# Altium project cm4gateway.PrjPcb (part 2 of 2)

## Sheet CPU_superviser.SchDoc: UNUSED INTERFACES
size A3; Engineer: M.GUENI; Revision: R0; SheetNumber: 10; SheetTotal: 10
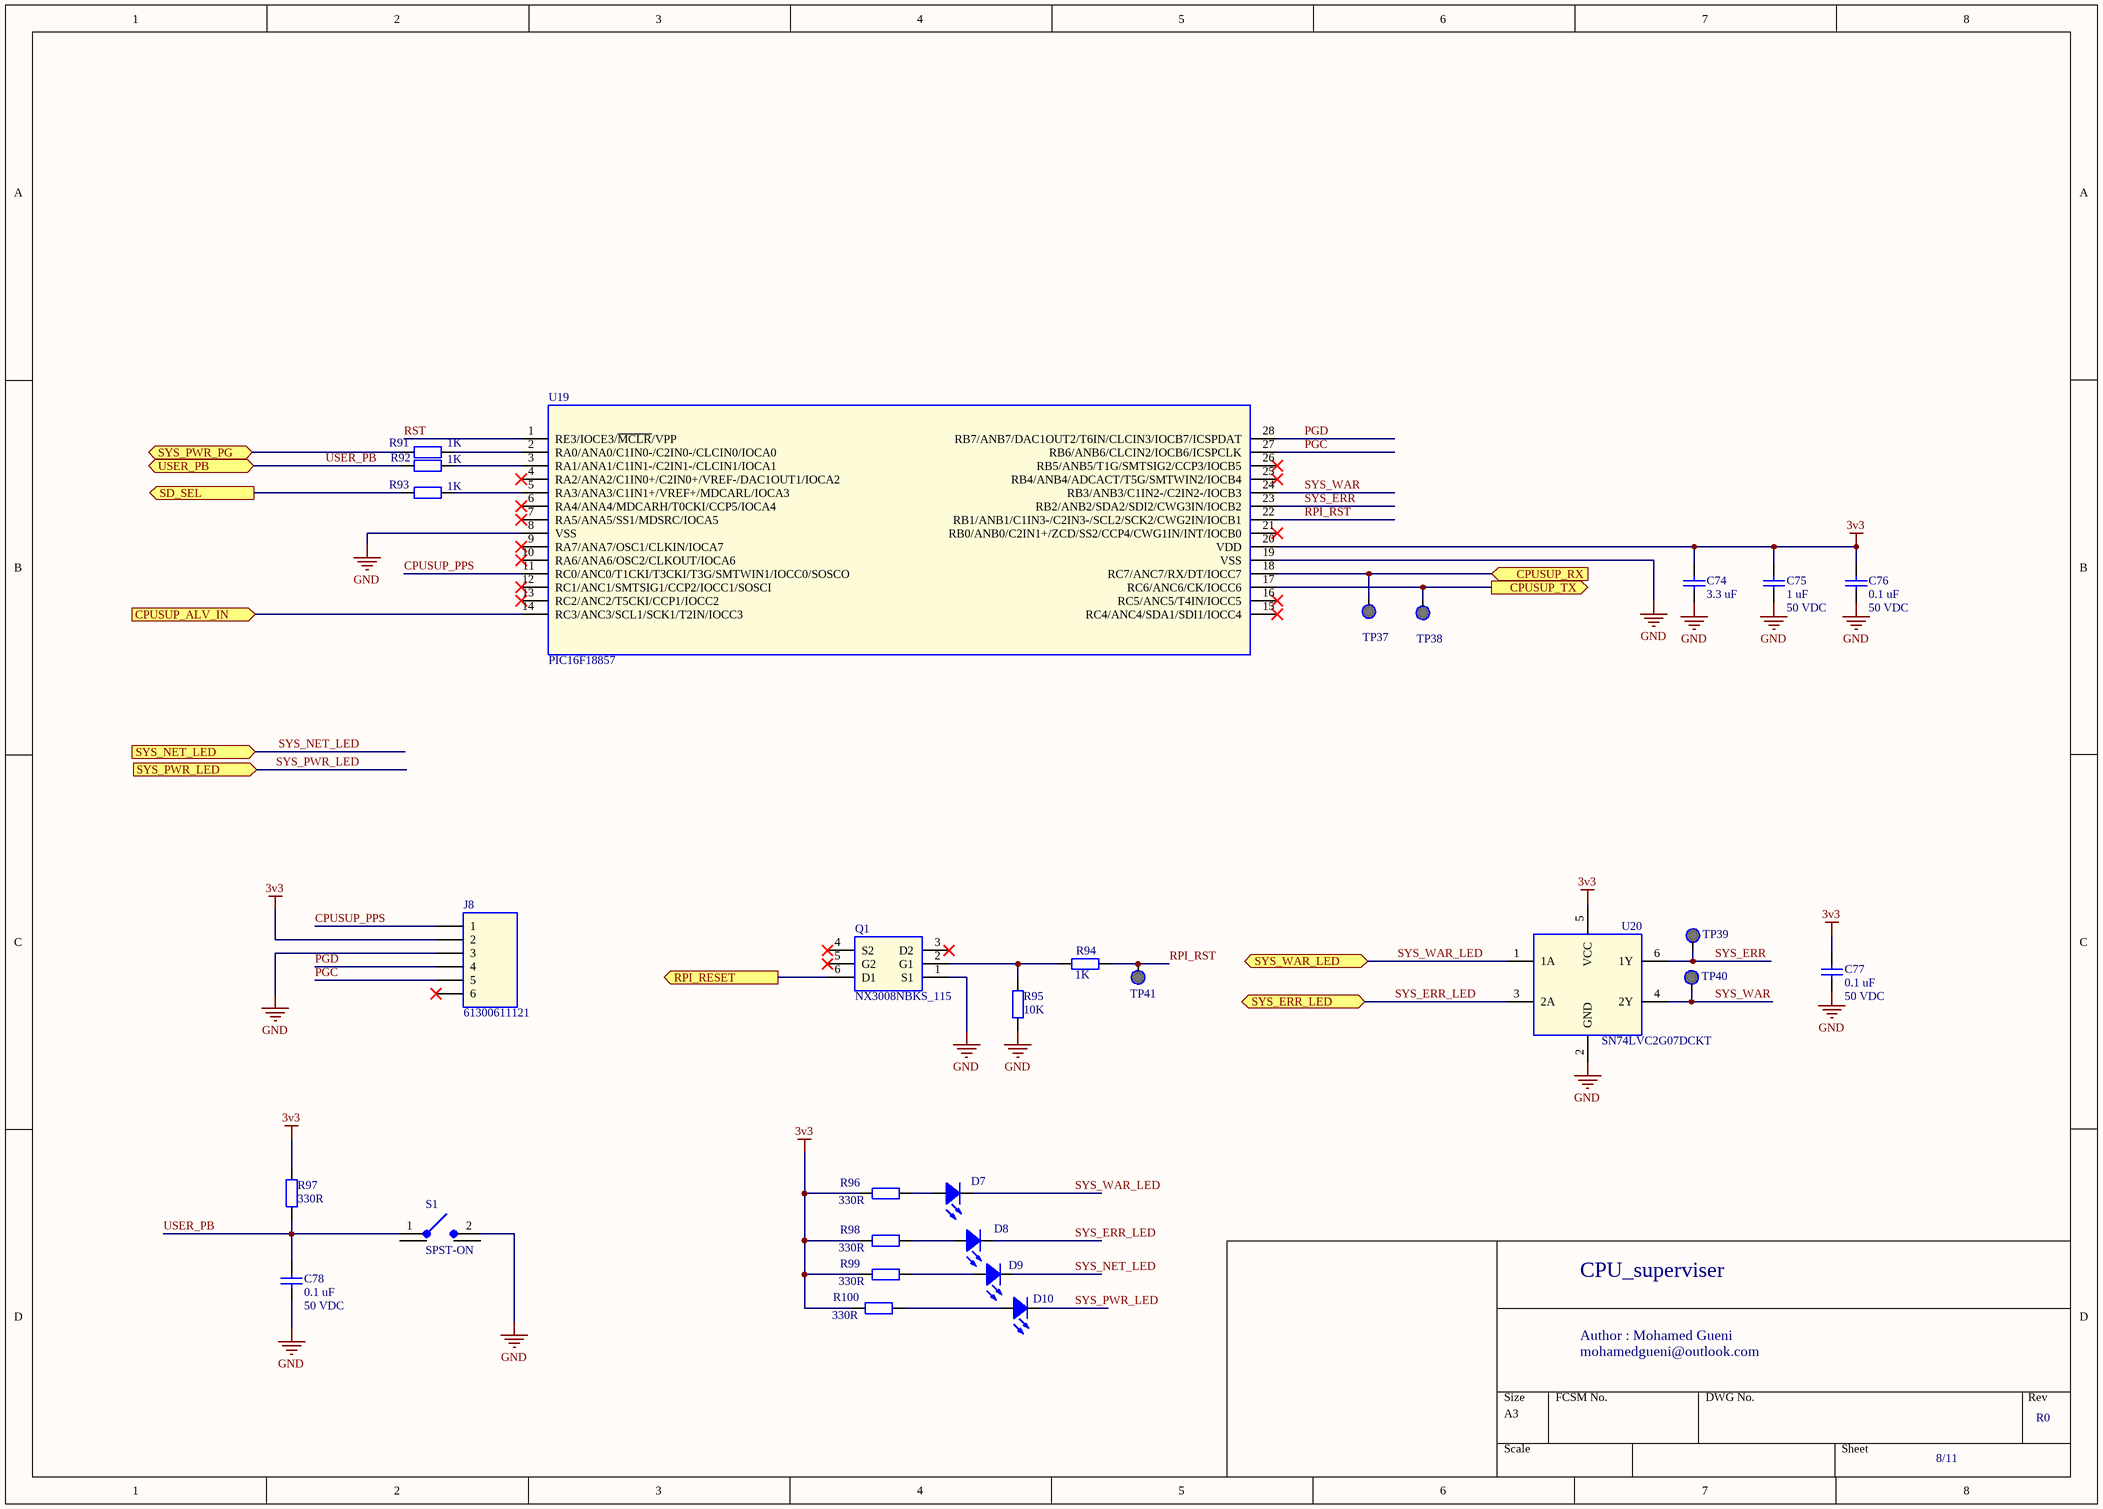
[diagram p9: CPU_superviser.SchDoc]

### Parts
C74  Value 1: 3.3 uF  [CAPC1608N]  (hidden comment: Capacitor)
C75  Value 1: 1 uF  Value 2: 50 VDC  [CAPC1608N]  (hidden comment: Capacitor)
C76  Value 1: 0.1 uF  Value 2: 50 VDC  [CAPC1608N]  (hidden comment: Capacitor)
C77  Value 1: 0.1 uF  Value 2: 50 VDC  [CAPC1608N]  (hidden comment: Capacitor)
C78  Value 1: 0.1 uF  Value 2: 50 VDC  [CAPC1608N]  (hidden comment: Capacitor)
D7  150060BS75000  [LED0603]  (value not drawn)
D8  150060RS75000  [LED0603]  (value not drawn)
D9  150060GS75000  [LED0603]  (value not drawn)
D10  150060GS75000  [LED0603]  (value not drawn)
J8  61300611121  [HDRV6W64P0X254]
Q1  NX3008NBKS_115  [SOT65P210X110-6N]
R91  Value 1: 1K  [RESC1608N]  (hidden comment: Resistor)
R92  Value 1: 1K  [RESC1608N]  (hidden comment: Resistor)
R93  Value 1: 1K  [RESC1608N]  (hidden comment: Resistor)
R94  Value 1: 1K  [RESC1608N]  (hidden comment: Resistor)
R95  Value 1: 10K  [RESC1608N]  (hidden comment: Resistor)
R96  Value 1: 330R  [RESC1608N]  (hidden comment: Resistor)
R97  Value 1: 330R  [RESC1608N]  (hidden comment: Resistor)
R98  Value 1: 330R  [RESC1608N]  (hidden comment: Resistor)
R99  Value 1: 330R  [RESC1608N]  (hidden comment: Resistor)
R100  Value 1: 330R  [RESC1608N]  (hidden comment: Resistor)
S1  SPST-ON  [118250272]
TP37  Test Point  [TP]  (value not drawn)  (no BOM)
TP38  Test Point  [TP]  (value not drawn)  (no BOM)
TP39  Test Point  [TP]  (value not drawn)  (no BOM)
TP40  Test Point  [TP]  (value not drawn)  (no BOM)
TP41  Test Point  [TP]  (value not drawn)  (no BOM)
U19  PIC16F18857  [SOP65P780X200-28N]
U20  SN74LVC2G07DCKT  [SOT65P210X1106N]

### Ports
CPUSUP_ALV_IN (in), CPUSUP_RX (in), CPUSUP_TX (out), RPI_RESET (out), SD_SEL (out), SYS_ERR_LED (bidir), SYS_NET_LED (in), SYS_PWR_LED (in), SYS_PWR_PG (bidir), SYS_WAR_LED (bidir), USER_PB (bidir)

### Nets
3V3: C74.2 C75.2 C76.2 C77.2 J8.2 R96.1 R97.2 R98.1 R99.1 R100.1 U19.20(VDD) U20.5(VCC)
GND: C74.1 C75.1 C76.1 C77.1 C78.1 J8.3 Q1.1(S1) R95.1 S1.2(NO) U19.8(VSS) U19.19(VSS) U20.2(GND)
CPUSUP_PPS: J8.1 U19.11(RC0/ANC0/T1CKI/T3CKI/T3G/SMTWIN1/IOCC0/SOSCO)
PGC: J8.5 U19.27(RB6/ANB6/CLCIN2/IOCB6/ICSPCLK)
PGD: J8.4 U19.28(RB7/ANB7/DAC1OUT2/T6IN/CLCIN3/IOCB7/ICSPDAT)
RPI_RST: R94.2 TP41.1 U19.22(RB1/ANB1/C1IN3-/C2IN3-/SCL2/SCK2/CWG2IN/IOCB1)
RPi_RXD3: TP38.1 U19.17(RC6/ANC6/CK/IOCC6) ; port CPUSUP_TX
RPi_TXD3: TP37.1 U19.18(RC7/ANC7/RX/DT/IOCC7) ; port CPUSUP_RX
RST: U19.1(RE3/IOCE3/~{MCLR}/VPP)
SEL_SD: R93.1 ; port SD_SEL
SYS_ERR: TP39.1 U19.23(RB2/ANB2/SDA2/SDI2/CWG3IN/IOCB2) U20.6(1Y)
SYS_ERR_LED: D8.1(K) U20.3(2A) ; port SYS_ERR_LED
SYS_NET_LED: D9.1(K) ; port SYS_NET_LED
SYS_PWR_LED: D10.1(K) ; port SYS_PWR_LED
SYS_WAR: TP40.1 U19.24(RB3/ANB3/C1IN2-/C2IN2-/IOCB3) U20.4(2Y)
SYS_WAR_LED: D7.1(K) U20.1(1A) ; port SYS_WAR_LED
USER_PB: C78.2 R92.1 R97.1 S1.1(COM) ; port USER_PB
NetD7_2: D7.2(A) R96.2
NetD8_2: D8.2(A) R98.2
NetD9_2: D9.2(A) R99.2
NetD10_2: D10.2(A) R100.2
NetQ1_2: Q1.2(G1) R94.1 R95.2
NetQ1_6: Q1.6(D1) ; port RPI_RESET
NetR15_2: R91.1 ; port SYS_PWR_PG
NetR91_2: R91.2 U19.2(RA0/ANA0/C1IN0-/C2IN0-/CLCIN0/IOCA0)
NetR92_2: R92.2 U19.3(RA1/ANA1/C1IN1-/C2IN1-/CLCIN1/IOCA1)
NetR93_2: R93.2 U19.5(RA3/ANA3/C1IN1+/VREF+/MDCARL/IOCA3)
NetU4_58: U19.14(RC3/ANC3/SCL1/SCK1/T2IN/IOCC3) ; port CPUSUP_ALV_IN

Not connected (* = marked no-connect by the designer): J8 6*; Q1 3(D2)* 4(S2)* 5(G2)*; S1 MH1 MH2; U19 4(RA2/ANA2/C1IN0+/C2IN0+/VREF-/DAC1OUT1/IOCA2)* 6(RA4/ANA4/MDCARH/T0CKI/CCP5/IOCA4)* 7(RA5/ANA5/SS1/MDSRC/IOCA5)* 9(RA7/ANA7/OSC1/CLKIN/IOCA7)* 10(RA6/ANA6/OSC2/CLKOUT/IOCA6)* 12(RC1/ANC1/SMTSIG1/CCP2/IOCC1/SOSCI)* 13(RC2/ANC2/T5CKI/CCP1/IOCC2)* 15(RC4/ANC4/SDA1/SDI1/IOCC4)* 16(RC5/ANC5/T4IN/IOCC5)* 21(RB0/ANB0/C2IN1+/ZCD/SS2/CCP4/CWG1IN/INT/IOCB0)* 25(RB4/ANB4/ADCACT/T5G/SMTWIN2/IOCB4)* 26(RB5/ANB5/T1G/SMTSIG2/CCP3/IOCB5)*

### Notes on the sheet
- CPU_superviser
- Author : Mohamed Gueni
- mohamedgueni@outlook.com
- 8/11
- R0
- Title:
- Micro Device Tunisie
- Size:
- Date:
- File:
- A3
- Engineer :
- Revision:
- Sheet
- of
- Cyber Parc  Hammam Sousse
- Avenue Charles De Gaulle
- 4011, Hammam-Sousse, Tunisie
- contact@mdtunisie.com

### Library data of the parts
C74 = CAP-000000065: Part Number: CAP-000000008; FTP: 0603
C75 = CAP-000000062: Part Number: CAP-000000005; MAN: KEMET; MANREF: C0603C105K8PACTU; DES: Multilayer Ceramic Capacitors MLCC - SMD/SMT 10v 1uF X5R 0603 10%; TOL: 10 %; FTP: 0603; SUP: Mouser; SUPREF: 80-C0603C105K8P; NOTE: _
C76-C78 = CAP-000000060: Part Number: CAP-000000003; MAN: KEMET; MANREF: C0603C104M5RAC; DES: Multilayer Ceramic Capacitors MLCC - SMD/SMT 50V 0.1uF 0603 X7R 20%; TOL: 20 %; FTP: 0603; SUP: Mouser; SUPREF: 80-C0603C104M5RAC; NOTE: _
D7 = LED-000000008: Part Number: LED-000000003; MAN: Wurth Elektronik; DES: Standard LEDs - SMD WL-SMCW SMDMono TpVw Waterclr 0603 Blue; Value 1: 0.02A; Value 2: 3.2 V; TOL: _; FTP: 0603; SUP: Mouser; SUPREF: 710-150060BS75000; MANREF: 150060BS75000; NOTE: _
D8 = LED-000000006: Part Number: LED-000000001; MAN: Wurth Elektronik; DES: Standard LEDs - SMD WL-SMCW SMDMono TpVw Waterclr 0603 Red; Value 1: 0.02A; Value 2: 2 V; TOL: _; FTP: 0603; SUP: Mouser; SUPREF: 710-150060RS75000; MANREF: 150060RS75000; NOTE: _
D9 D10 = LED-000000007: Part Number: LED-000000002; MAN: Wurth Elektronik; DES: Standard LEDs - SMD WL-SMCW SMDMono TpVw Waterclr 0603 Green; Value 1: 0.02A; Value 2: 3.2 V; TOL: _; FTP: 0603; SUP: Mouser; SUPREF: 710-150060GS75000; MANREF: 150060GS75000; NOTE: _
J8 = CON-000000010: MAN: Wurth Elektronik; DES: Headers & Wire Housings WR-PHD 2.54mm 6Pin T HT Header; Value 1: _; FTP: THT; SUP: Mouser; SUPREF: 710-61300611121; Part Number: CON-000000010; MANREF: 61300611121; Value 2: _; TOL: _; NOTE: _
Q1 = TRM-000000005: Part Number: TRM-000000002; MAN: Nexperia; MANREF: NX3008NBKS,115; DES: MOSFETs 30 V, 350 mA dual N-channel Trench MOSFET; Value 1: 350 mA; Value 2: 30V; TOL: _; FTP: TSSOP-6; SUP: Mouser; SUPREF: 771-NX3008NBKS,115; NOTE: -
R91-R94 = RES-000000125: Part Number: RES-000000001; MAN: KOA Speer; MANREF: RN731JTTD1001F25; DES: Thin Film Resistors - SMD 1kOhm,0603,1%,25ppm, 63mW,50V; Value 2: 0.63W; TOL: 1%; FTP: 0603; SUP: Mouser; SUPREF: 660-RN731JTTD1001F25; NOTE: _
R95 = RES-000000131: Part Number: RES-000000007; MAN: KOA Speer; MANREF: RN731JTTD1002F25; DES: Thin Film Resistors - SMD 10kOhm,0603,1%,25ppm ,63mW,50V; Value 2: 0.63W; TOL: 1%; FTP: 0603; SUP: Mouser; SUPREF: 660-RN731JTTD1002F25; NOTE: _
R96-R100 = RES-000000132: Part Number: RES-000000008; MAN: KOA Speer; SUP: Mouser; NOTE: _
S1 = S-000000001: MAN: TE Connectivity / P&B; MANREF: 1-1825027-2; DES: Tactile Switches R/A TACT 260 PB SWITCH; Value 1: 50 mA; Value 2: 24 VDC; SUP: Mouser; SUPREF: 506-1-1825027-2; Part Number: S-000000001; NOTE: -
TP37-TP41 = MIS-000000003: Part Number: MIS-000000002; MAN: _; MANREF: _; DES: _; Value 1: _; Value 2: _; TOL: _; FTP: _; SUP: _; SUPREF: _; NOTE: _
U19 = MCU-000000003: Part Number: MCU-000000002; MAN: Microchip Technology; MANREF: PIC16F18857T-I/SS; DES: 8-bit Microcontrollers - MCU 8-Bit MCU 56KB Flash 4KB RAM 256B EE CIP; Value 1: _; FTP: SSOP-28; SUP: Mouser; SUPREF: 579-PIC16F18857TI/SS; Value 2: _; TOL: _; NOTE: _
U20 = GIC-000000009: Dual Buffer/Driver with Open-Drain Output; Manufacturer_Name: Texas Instruments; Geometry.Height: 1.1mm; DES: Buffers & Line Drivers Dual Buffer Driver A 595-SN74LVC2G07DCKR; Value 1: 5.5 V; Value 2: 32 mA; TOL: _; FTP: SOT-353-SC70-6; SUP: Mouser; SUPREF: 595-SN74LVC2G07DCKT; Mouser Part Number: 595-SN74LVC2G07DCKT; Mouser Price/Stock: https://www.mouser.co.uk/ProductDetail/Texas-Instruments/SN74LVC2G07DCKT?qs=pajgIaoyDUh%252B8BjKWdvxSw%3D%3D; Manufacturer_Part_Number: SN74LVC2G07DCKT; Datasheet Link: http://www.ti.com/lit/gpn/SN74LVC2G07; Part Number: GIC-000000009; MAN: Texas Instruments; MANREF: SN74LVC2G07DCKT; NOTE: _

## Sheet RPI.SchDoc: CELLULAR
size A2; Engineer: M.GUENI; Revision: R0; SheetNumber: 03; SheetTotal: 10
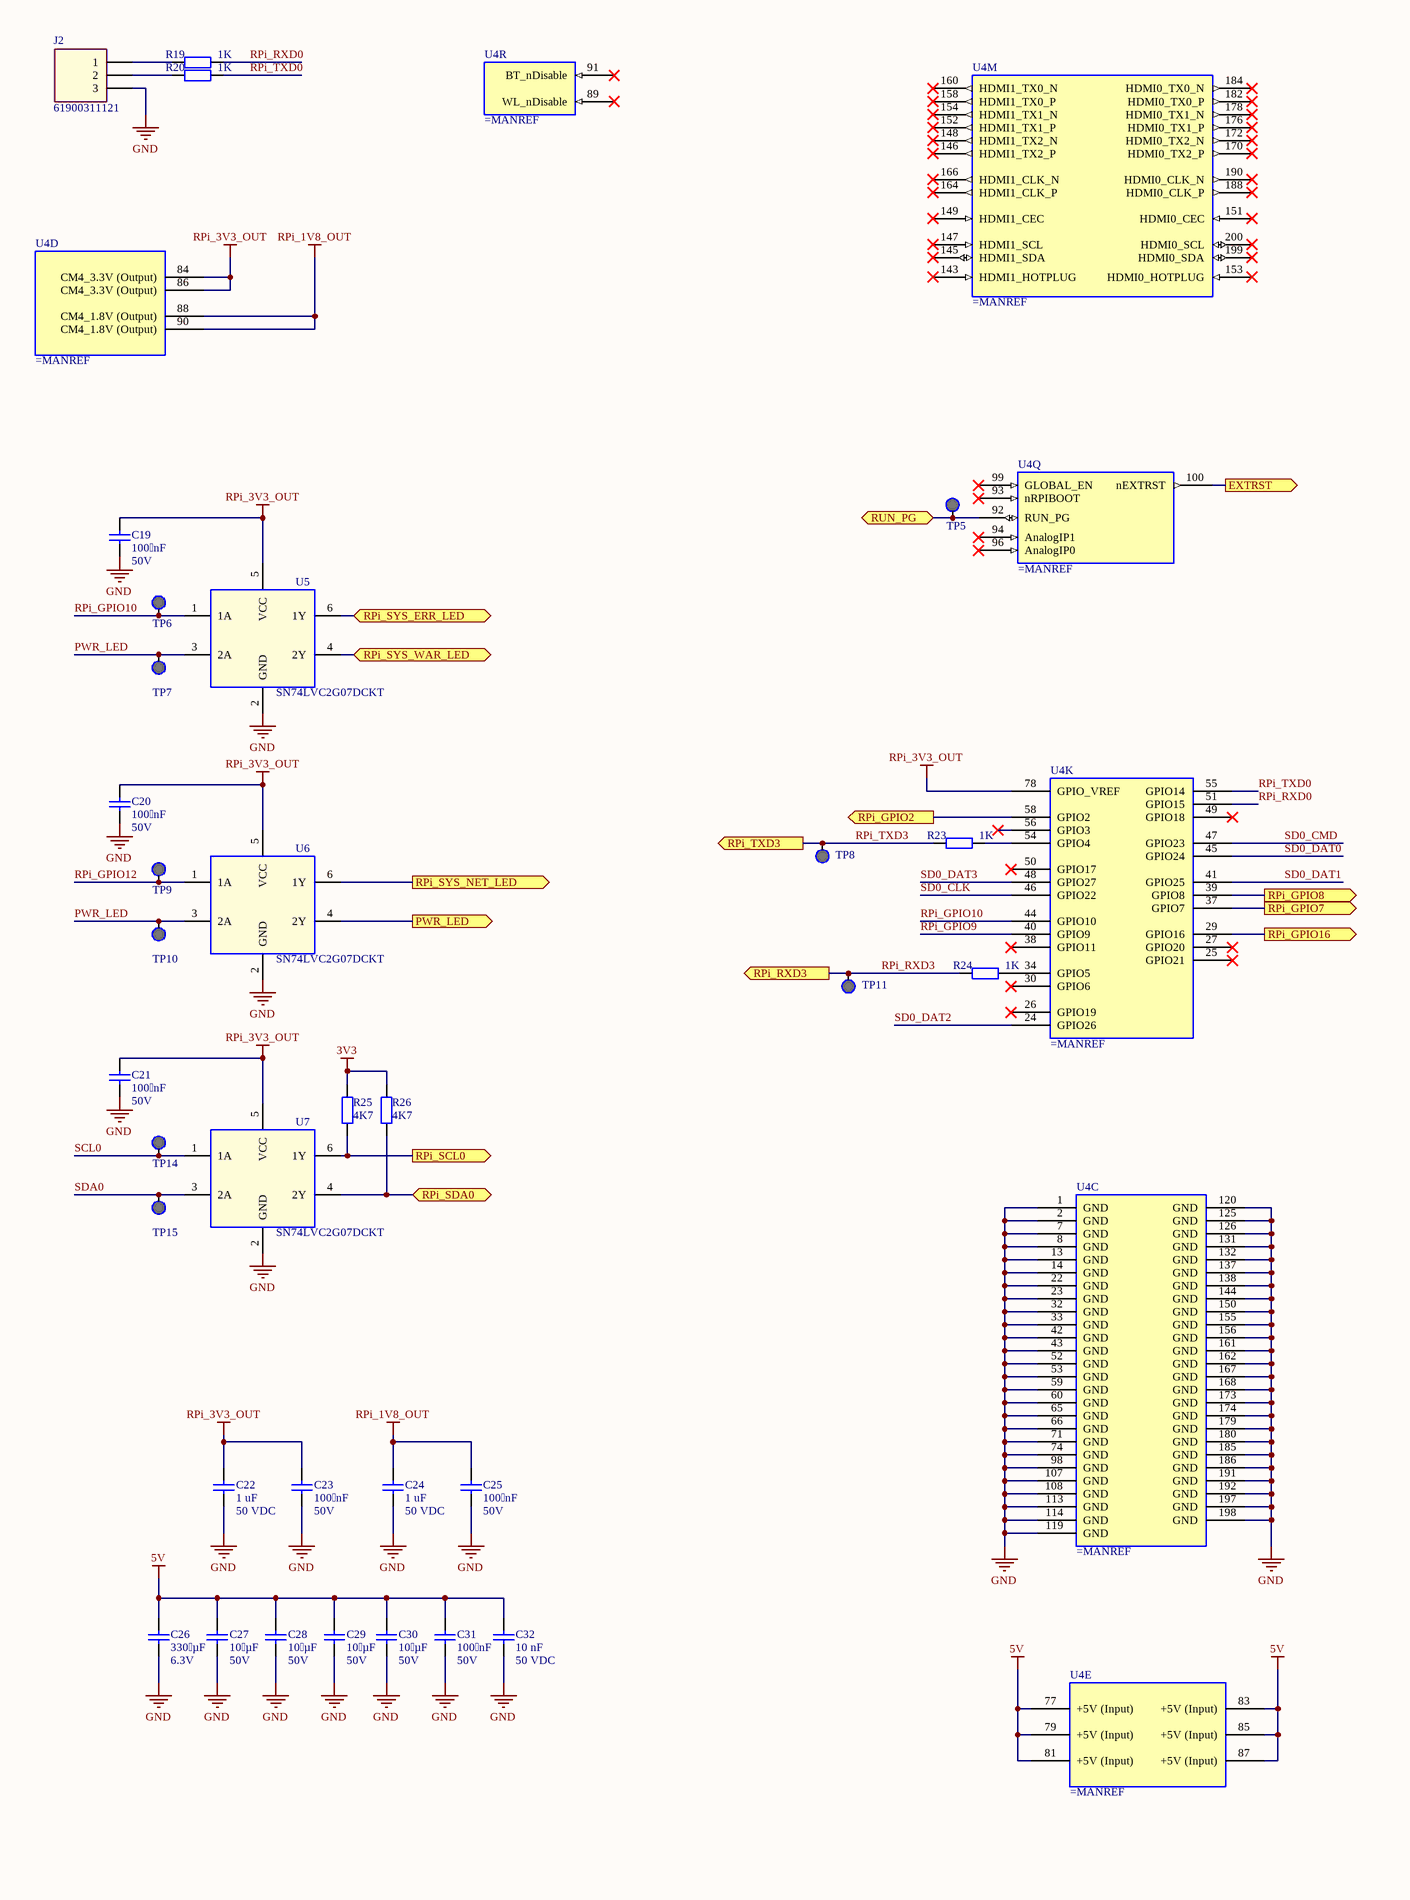
[diagram p10: RPI.SchDoc, left]
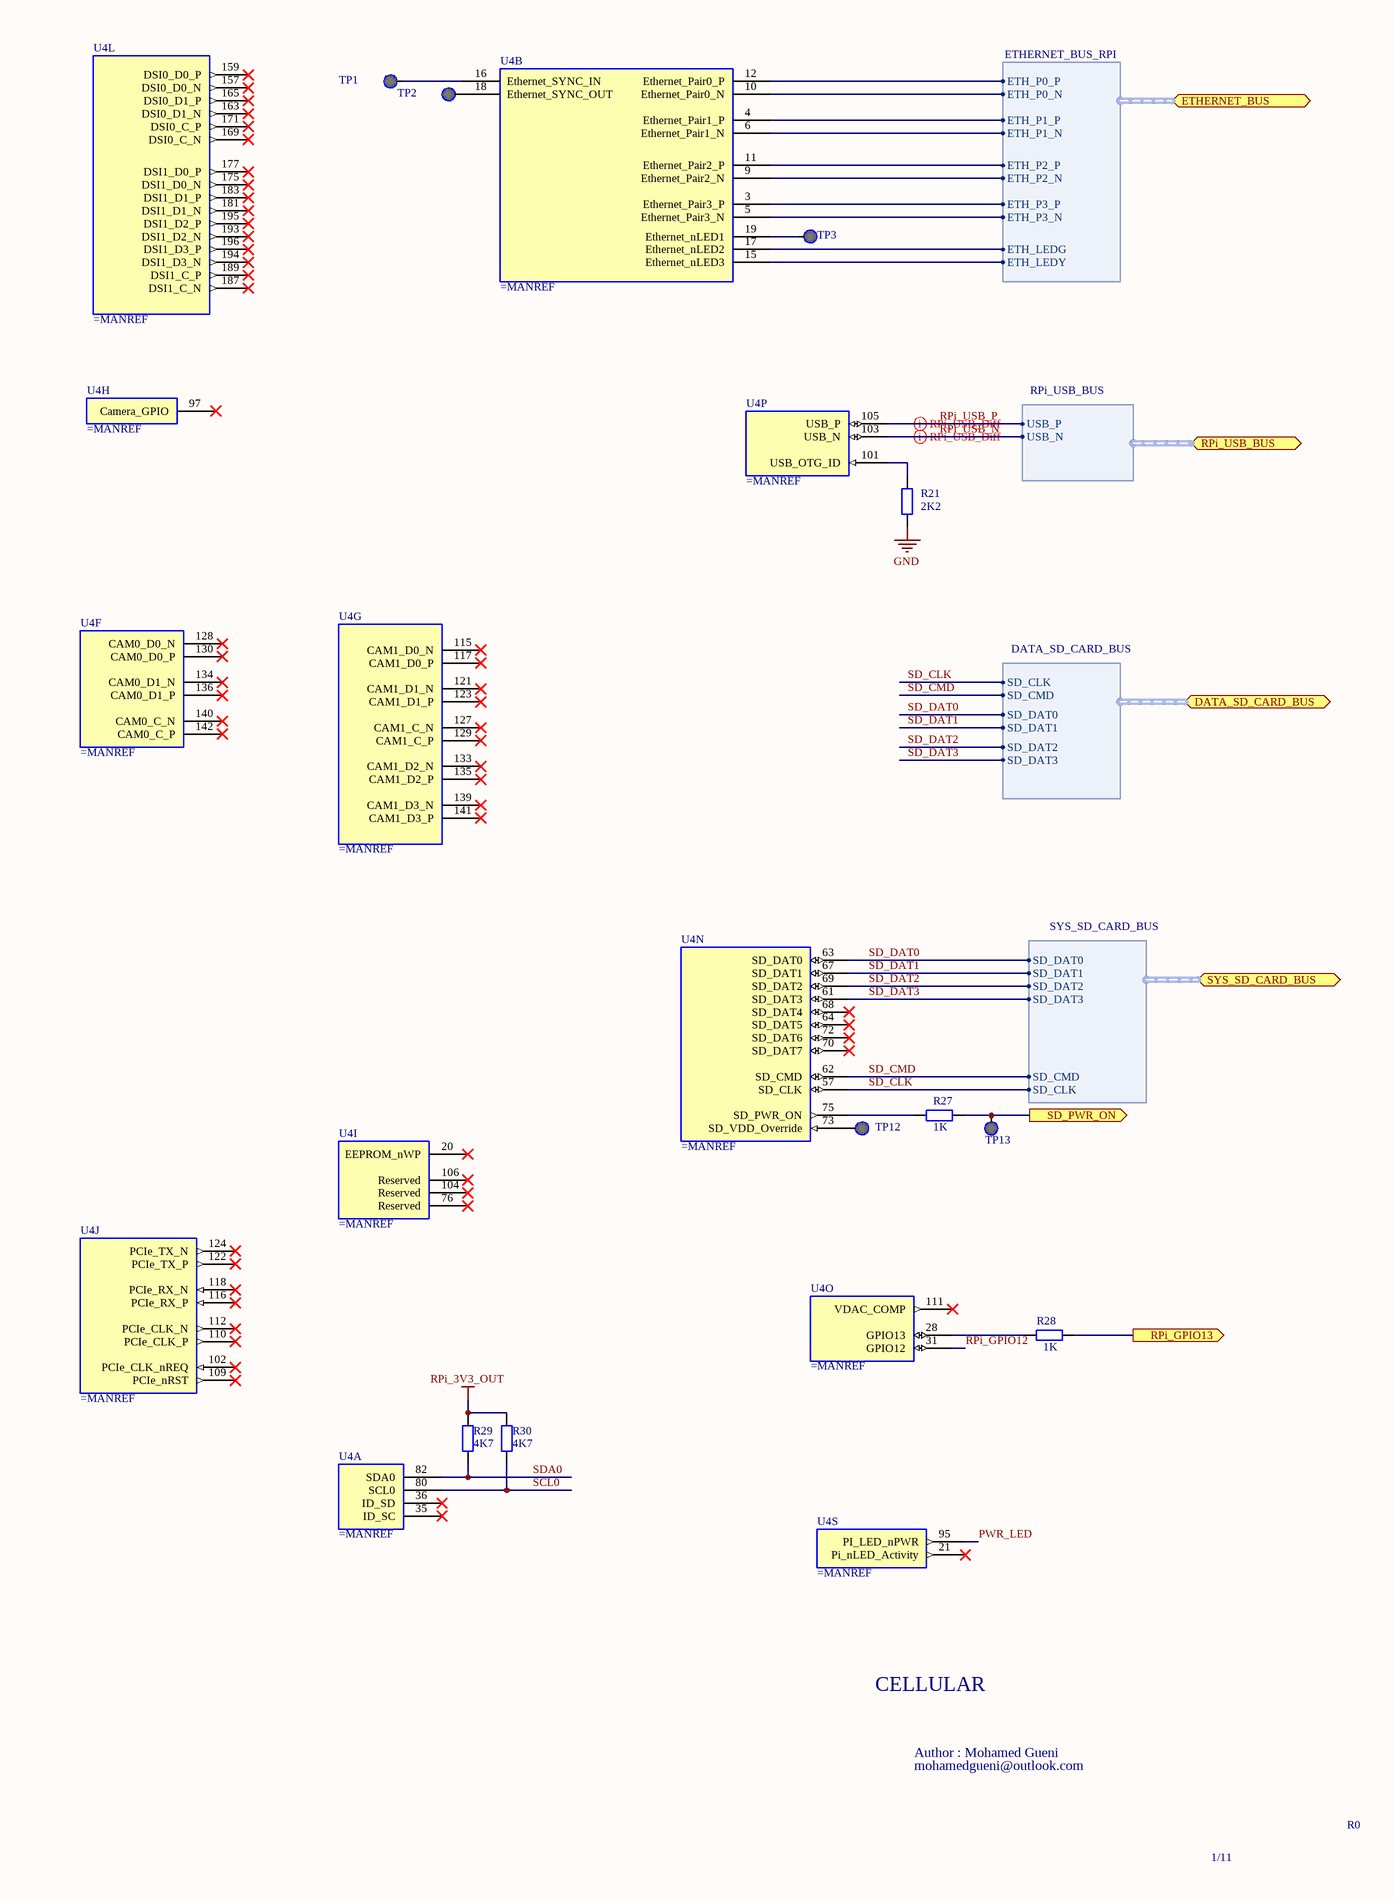
[diagram p11: RPI.SchDoc, right]

### Parts
C19  Value 1: 100 nF  Value 2: 50V  [CAPC1608N]  (hidden comment: GRM188R71H104KA93D)
C20  Value 1: 100 nF  Value 2: 50V  [CAPC1608N]  (hidden comment: GRM188R71H104KA93D)
C21  Value 1: 100 nF  Value 2: 50V  [CAPC1608N]  (hidden comment: GRM188R71H104KA93D)
C22  Value 1: 1 uF  Value 2: 50 VDC  [CAPC1608N]  (hidden comment: C0603C105K8PACTU)
C23  Value 1: 100 nF  Value 2: 50V  [CAPC1608N]  (hidden comment: GRM188R71H104KA93D)
C24  Value 1: 1 uF  Value 2: 50 VDC  [CAPC1608N]  (hidden comment: C0603C105K8PACTU)
C25  Value 1: 100 nF  Value 2: 50V  [CAPC1608N]  (hidden comment: GRM188R71H104KA93D)
C26  Value 1: 330 µF  Value 2: 6.3V  [CAPC1210]  (hidden comment: T491D337K006AT)
C27  Value 1: 10 µF  Value 2: 50V  [CAPC1608N]  (hidden comment: GRM188R61H106KAALD)
C28  Value 1: 10 µF  Value 2: 50V  [CAPC1608N]  (hidden comment: GRM188R61H106KAALD)
C29  Value 1: 10 µF  Value 2: 50V  [CAPC1608N]  (hidden comment: GRM188R61H106KAALD)
C30  Value 1: 10 µF  Value 2: 50V  [CAPC1608N]  (hidden comment: GRM188R61H106KAALD)
C31  Value 1: 100 nF  Value 2: 50V  [CAPC1608N]  (hidden comment: GRM188R71H104KA93D)
C32  Value 1: 10 nF  Value 2: 50 VDC  [CAPC1608N]  (hidden comment: C0603C103J5RACTU)
J2  61900311121  [61900311121]
R19  Value 1: 1K  [RESC1608N]  (hidden comment: RN731JTTD1001F25)
R20  Value 1: 1K  [RESC1608N]  (hidden comment: RN731JTTD1001F25)
R21  Value 1: 2K2  [RESC1608N]  (hidden comment: RN731JTTD2201F25)
R23  Value 1: 1K  [RESC1608N]  (hidden comment: RN731JTTD1001F25)
R24  Value 1: 1K  [RESC1608N]  (hidden comment: RN731JTTD1001F25)
R25  Value 1: 4K7  [RESC1608N]
R26  Value 1: 4K7  [RESC1608N]
R27  Value 1: 1K  [RESC1608N]  (hidden comment: RN731JTTD1001F25)
R28  Value 1: 1K  [RESC1608N]  (hidden comment: RN731JTTD1001F25)
R29  Value 1: 4K7  [RESC1608N]
R30  Value 1: 4K7  [RESC1608N]
TP1  Test Point  [TP]  (value not drawn)  (no BOM)
TP2  Test Point  [TP]  (value not drawn)  (no BOM)
TP3  Test Point  [TP]  (value not drawn)  (no BOM)
TP5  Test Point  [TP]  (value not drawn)  (no BOM)
TP6  Test Point  [TP]  (value not drawn)  (no BOM)
TP7  Test Point  [TP]  (value not drawn)  (no BOM)
TP8  Test Point  [TP]  (value not drawn)  (no BOM)
TP9  Test Point  [TP]  (value not drawn)  (no BOM)
TP10  Test Point  [TP]  (value not drawn)  (no BOM)
TP11  Test Point  [TP]  (value not drawn)  (no BOM)
TP12  Test Point  [TP]  (value not drawn)  (no BOM)
TP13  Test Point  [TP]  (value not drawn)  (no BOM)
TP14  Test Point  [TP]  (value not drawn)  (no BOM)
TP15  Test Point  [TP]  (value not drawn)  (no BOM)
U4  (no value)  [CM4]  (parts A,B,C,D,E,F,G,H,I,J,K,L,M,N,O,P,Q,R,S of 19)
U5  SN74LVC2G07DCKT  [SOT65P210X1106N]
U6  SN74LVC2G07DCKT  [SOT65P210X1106N]
U7  SN74LVC2G07DCKT  [SOT65P210X1106N]

### Ports
DATA_SD_CARD_BUS (bidir, harness DATA_SD_CARD_BUS), ETHERNET_BUS (bidir, harness ETHERNET_BUS_RPI), EXTRST (out), PWR_LED (out), RPi_GPIO2 (out), RPi_GPIO7 (out), RPi_GPIO8 (out), RPi_GPIO13 (out), RPi_GPIO16 (out), RPi_RXD3 (out), RPi_SCL0 (out), RPi_SDA0 (bidir), RPi_SYS_ERR_LED (bidir), RPi_SYS_NET_LED (out), RPi_SYS_WAR_LED (bidir), RPi_TXD3 (out), RPi_USB_BUS (bidir, harness RPi_USB_BUS), RUN_PG (bidir), SD_PWR_ON (out), SYS_SD_CARD_BUS (bidir, harness SYS_SD_CARD_BUS)

### Harnesses
RPi_USB_BUS: USB_N, USB_P
DATA_SD_CARD_BUS: SD_CMD, SD_CLK, SD_DAT1, SD_DAT0, SD_DAT3, SD_DAT2
SYS_SD_CARD_BUS: SD_CMD, SD_CLK, SD_DAT1, SD_DAT0, SD_DAT3, SD_DAT2
ETHERNET_BUS_RPI: ETH_P3_P, ETH_P3_N, ETH_P0_N, ETH_P0_P, ETH_P1_N, ETH_P1_P, ETH_P2_P, ETH_P2_N, ETH_LEDG, ETH_LEDY

### Nets
3V3: R25.2 R26.2
5V: C26.2 C27.2 C28.2 C29.2 C30.2 C31.2 C32.2 U4.77(+5V_(Input)) U4.79(+5V_(Input)) U4.81(+5V_(Input)) U4.83(+5V_(Input)) U4.85(+5V_(Input)) U4.87(+5V_(Input))
GND: C19.1 C20.1 C21.1 C22.1 C23.1 C24.1 C25.1 C26.1 C27.1 C28.1 C29.1 C30.1 C31.1 C32.1 J2.3 R21.1 U4.1(GND) U4.2(GND) U4.7(GND) U4.8(GND) U4.13(GND) U4.14(GND) U4.22(GND) U4.23(GND) U4.32(GND) U4.33(GND) U4.42(GND) U4.43(GND) U4.52(GND) U4.53(GND) U4.59(GND) U4.60(GND) U4.65(GND) U4.66(GND) U4.71(GND) U4.74(GND) U4.98(GND) U4.107(GND) U4.108(GND) U4.113(GND) U4.114(GND) U4.119(GND) U4.120(GND) U4.125(GND) U4.126(GND) U4.131(GND) U4.132(GND) U4.137(GND) U4.138(GND) U4.144(GND) U4.150(GND) U4.155(GND) U4.156(GND) U4.161(GND) U4.162(GND) U4.167(GND) U4.168(GND) U4.173(GND) U4.174(GND) U4.179(GND) U4.180(GND) U4.185(GND) U4.186(GND) U4.191(GND) U4.192(GND) U4.197(GND) U4.198(GND) U5.2(GND) U6.2(GND) U7.2(GND)
RPi_1V8_OUT: C24.2 C25.2 U4.88(CM4_1.8V_(Output)) U4.90(CM4_1.8V_(Output))
RPi_3V3_OUT: C19.2 C20.2 C21.2 C22.2 C23.2 R29.1 R30.1 U4.78(GPIO_VREF) U4.84(CM4_3.3V_(Output)) U4.86(CM4_3.3V_(Output)) U5.5(VCC) U6.5(VCC) U7.5(VCC)
ETH_LEDG: U4.17(Ethernet_nLED2) ; port ETHERNET_BUS.ETH_LEDG
ETH_LEDY: U4.15(Ethernet_nLED3) ; port ETHERNET_BUS.ETH_LEDY
ETH_P0_N: U4.10(Ethernet_Pair0_N) ; port ETHERNET_BUS.ETH_P0_N
ETH_P0_P: U4.12(Ethernet_Pair0_P) ; port ETHERNET_BUS.ETH_P0_P
ETH_P1_N: U4.6(Ethernet_Pair1_N) ; port ETHERNET_BUS.ETH_P1_N
ETH_P1_P: U4.4(Ethernet_Pair1_P) ; port ETHERNET_BUS.ETH_P1_P
ETH_P2_N: U4.9(Ethernet_Pair2_N) ; port ETHERNET_BUS.ETH_P2_N
ETH_P2_P: U4.11(Ethernet_Pair2_P) ; port ETHERNET_BUS.ETH_P2_P
ETH_P3_N: U4.5(Ethernet_Pair3_N) ; port ETHERNET_BUS.ETH_P3_N
ETH_P3_P: U4.3(Ethernet_Pair3_P) ; port ETHERNET_BUS.ETH_P3_P
I2C_SCL: R25.1 U7.6(1Y) ; port RPi_SCL0
I2C_SDA: R26.1 U7.4(2Y) ; port RPi_SDA0
PWR_LED: TP7.1 TP10.1 U4.95(PI_LED_nPWR) U5.3(2A) U6.3(2A)
RESET_IN: U4.100(nEXTRST) ; port EXTRST
RPi_GPIO9: U4.40(GPIO9)
RPi_GPIO10: TP6.1 U4.44(GPIO10) U5.1(1A)
RPi_GPIO12: TP9.1 U4.31(GPIO12) U6.1(1A)
RPi_RXD0: R19.2 U4.51(GPIO15)
RPi_RXD3: R24.1 TP11.1 ; port RPi_RXD3
RPi_TXD0: R20.2 U4.55(GPIO14)
RPi_TXD3: R23.1 TP8.1 ; port RPi_TXD3
RPi_USB_N: U4.103(USB_N) ; port RPi_USB_BUS.USB_N
RPi_USB_P: U4.105(USB_P) ; port RPi_USB_BUS.USB_P
SCL0: R30.2 TP14.1 U4.80(SCL0) U7.1(1A)
SD0_CLK: U4.46(GPIO22)
SD0_CMD: U4.47(GPIO23)
SD0_DAT0: U4.45(GPIO24)
SD0_DAT1: U4.41(GPIO25)
SD0_DAT2: U4.24(GPIO26)
SD0_DAT3: U4.48(GPIO27)
SD_CLK: U4.57(SD_CLK) ; port DATA_SD_CARD_BUS.SD_CLK, port SYS_SD_CARD_BUS.SD_CLK
SD_CMD: U4.62(SD_CMD) ; port DATA_SD_CARD_BUS.SD_CMD, port SYS_SD_CARD_BUS.SD_CMD
SD_DAT0: U4.63(SD_DAT0) ; port DATA_SD_CARD_BUS.SD_DAT0, port SYS_SD_CARD_BUS.SD_DAT0
SD_DAT1: U4.67(SD_DAT1) ; port DATA_SD_CARD_BUS.SD_DAT1, port SYS_SD_CARD_BUS.SD_DAT1
SD_DAT2: U4.69(SD_DAT2) ; port DATA_SD_CARD_BUS.SD_DAT2, port SYS_SD_CARD_BUS.SD_DAT2
SD_DAT3: U4.61(SD_DAT3) ; port DATA_SD_CARD_BUS.SD_DAT3, port SYS_SD_CARD_BUS.SD_DAT3
SDA0: R29.2 TP15.1 U4.82(SDA0) U7.3(2A)
SYS_ERR_LED: U5.6(1Y) ; port RPi_SYS_ERR_LED
SYS_NET_LED: U6.6(1Y) ; port RPi_SYS_NET_LED
SYS_PWR_LED: U6.4(2Y) ; port PWR_LED
SYS_WAR_LED: U5.4(2Y) ; port RPi_SYS_WAR_LED
USER_PB: R28.1 ; port RPi_GPIO13
NetJ2_1: J2.1 R19.1
NetJ2_2: J2.2 R20.1
NetR1_2: TP5.1 U4.92(RUN_PG) ; port RUN_PG
NetR4_1: U4.29(GPIO16) ; port RPi_GPIO16
NetR21_2: R21.2 U4.101(USB_OTG_ID)
NetR23_2: R23.2 U4.54(GPIO4)
NetR24_2: R24.2 U4.34(GPIO5)
NetR27_1: R27.1 TP13.1 ; port SD_PWR_ON
NetR27_2: R27.2 U4.75(SD_PWR_ON)
NetR28_2: R28.2 U4.28(GPIO13)
NetR103_2: U4.37(GPIO7) ; port RPi_GPIO7
NetR105_2: U4.39(GPIO8) ; port RPi_GPIO8
NetTP1_1: TP1.1 U4.16(Ethernet_SYNC_IN)
NetTP2_1: TP2.1 U4.18(Ethernet_SYNC_OUT)
NetTP3_1: TP3.1 U4.19(Ethernet_nLED1)
NetTP12_1: TP12.1 U4.73(SD_VDD_Override)
NetU4_58: U4.58(GPIO2) ; port RPi_GPIO2

Not connected (* = marked no-connect by the designer): U4 20(EEPROM_nWP)* 21(Pi_nLED_Activity)* 25(GPIO21)* 26(GPIO19)* 27(GPIO20)* 30(GPIO6)* 35(ID_SC)* 36(ID_SD)* 38(GPIO11)* 49(GPIO18)* 50(GPIO17)* 56(GPIO3)* 64(SD_DAT5)* 68(SD_DAT4)* 70(SD_DAT7)* 72(SD_DAT6)* 76(Reserved)* 89(WL_nDisable)* 91(BT_nDisable)* 93(nRPIBOOT)* 94(AnalogIP1)* 96(AnalogIP0)* 97(Camera_GPIO)* 99(GLOBAL_EN)* 102(PCIe_CLK_nREQ)* 104(Reserved)* 106(Reserved)* 109(PCIe_nRST)* 110(PCIe_CLK_P)* 111(VDAC_COMP)* 112(PCIe_CLK_N)* 115(CAM1_D0_N)* 116(PCIe_RX_P)* 117(CAM1_D0_P)* 118(PCIe_RX_N)* 121(CAM1_D1_N)* 122(PCIe_TX_P)* 123(CAM1_D1_P)* 124(PCIe_TX_N)* 127(CAM1_C_N)* 128(CAM0_D0_N)* 129(CAM1_C_P)* 130(CAM0_D0_P)* 133(CAM1_D2_N)* 134(CAM0_D1_N)* 135(CAM1_D2_P)* 136(CAM0_D1_P)* 139(CAM1_D3_N)* 140(CAM0_C_N)* 141(CAM1_D3_P)* 142(CAM0_C_P)* 143(HDMI1_HOTPLUG)* 145(HDMI1_SDA)* 146(HDMI1_TX2_P)* 147(HDMI1_SCL)* 148(HDMI1_TX2_N)* 149(HDMI1_CEC)* 151(HDMI0_CEC)* 152(HDMI1_TX1_P)* 153(HDMI0_HOTPLUG)* 154(HDMI1_TX1_N)* 157(DSI0_D0_N)* 158(HDMI1_TX0_P)* 159(DSI0_D0_P)* 160(HDMI1_TX0_N)* 163(DSI0_D1_N)* 164(HDMI1_CLK_P)* 165(DSI0_D1_P)* 166(HDMI1_CLK_N)* 169(DSI0_C_N)* 170(HDMI0_TX2_P)* 171(DSI0_C_P)* 172(HDMI0_TX2_N)* 175(DSI1_D0_N)* 176(HDMI0_TX1_P)* 177(DSI1_D0_P)* 178(HDMI0_TX1_N)* 181(DSI1_D1_N)* 182(HDMI0_TX0_P)* 183(DSI1_D1_P)* 184(HDMI0_TX0_N)* 187(DSI1_C_N)* 188(HDMI0_CLK_P)* 189(DSI1_C_P)* 190(HDMI0_CLK_N)* 193(DSI1_D2_N)* 194(DSI1_D3_N)* 195(DSI1_D2_P)* 196(DSI1_D3_P)* 199(HDMI0_SDA)* 200(HDMI0_SCL)*

### Layout directives
differential pair; differential pair class RPi_USB_Diff: RPi_USB_N, RPi_USB_P

### Notes on the sheet
- CELLULAR
- Author : Mohamed Gueni
- mohamedgueni@outlook.com
- 1/11
- R0
- Title:
- Micro Device Tunisie
- Size:
- Date:
- File:
- A3
- Engineer :
- Revision:
- Sheet
- of
- Cyber Parc  Hammam Sousse
- Avenue Charles De Gaulle
- 4011, Hammam-Sousse, Tunisie
- contact@mdtunisie.com

### Library data of the parts
C19-C21 C23 C25 C31 = CAP-000000017: MAN: Murata; DES: Ceramic Capacitor, 100 nF, 50V, X7R, 0603; FTP: 603; SUPREF: 81-GRM188R71H104KA93D; Part Number: CAP-000000017; MANREF: GRM188R71H104KA93D
C22 C24 = CAP-000000062: Part Number: CAP-000000005; MAN: KEMET; DES: Multilayer Ceramic Capacitors MLCC - SMD/SMT 10v 1uF X5R 0603 10%; TOL: 10 %; FTP: 0603; SUP: Mouser; SUPREF: 80-C0603C105K8P; NOTE: _; MANREF: C0603C105K8PACTU
C26 = CAP-000000068: Part Number: CAP-000000011; MAN: KEMET; DES: Tantalum Capacitor, 330 µF, 6.3V, 1210; FTP: 1210; SUPREF: 581-T491D337K006AT; MANREF: T491D337K006AT
C27-C30 = CAP-000000025: MAN: Murata; DES: Ceramic Capacitor, 10 µF, 50V, X5R, 0603; FTP: 603; SUPREF: 81-GRM188R61H106KAALD; Part Number: CAP-000000025; MANREF: GRM188R61H106KAALD
C32 = CAP-000000063: Part Number: CAP-000000006; MAN: KEMET; DES: Multilayer Ceramic Capacitors MLCC - SMD/SMT 50V 0.01uF 0603 X7R 5%; TOL: 5 %; FTP: 0603; SUP: Mouser; SUPREF: 80-C0603C103J5R; NOTE: _; MANREF: C0603C103J5RACTU
J2 = CON-000000013: MAN: Wurth Elektronik; DES: Headers & Wire Housings WR-WTB 2.54mm Male 3Pin Lckg; Value 1: _; FTP: THT; SUP: Mouser; SUPREF: 710-61900311121; Part Number: CON-000000013; MANREF: 61900311121; Value 2: _; TOL: _; NOTE: _
R19 R20 R23 R24 R27 R28 = RES-000000125: Part Number: RES-000000001; MAN: KOA Speer; DES: Thin Film Resistors - SMD 1kOhm,0603,1%,25ppm, 63mW,50V; Value 2: 0.63W; TOL: 1%; FTP: 0603; SUP: Mouser; SUPREF: 660-RN731JTTD1001F25; NOTE: _; MANREF: RN731JTTD1001F25
R21 = RES-000000130: Part Number: RES-000000006; MAN: KOA Speer; DES: Thin Film Resistors - SMD 2.2kOhm,0603,1%,25pp m,63mW,50V; Value 2: 0.1W; TOL: 1%; FTP: 0603; SUP: Mouser; SUPREF: 660-RN731JTTD2201F25; NOTE: _; MANREF: RN731JTTD2201F25
R25 R26 R29 R30 = RES-000000145: Part Number: RES-000000010; FTP: 0603; SUP: Mouser; NOTE: _
TP1-TP3 TP5-TP15 = MIS-000000003: Part Number: MIS-000000002; MAN: _; MANREF: _; DES: _; Value 1: _; Value 2: _; TOL: _; FTP: _; SUP: _; SUPREF: _; NOTE: _
U4 = MIS-000000006: NOTE: _; Part Number: MIS-000000006
U5-U7 = GIC-000000009: as U20 on sheet CPU_superviser; Mouser Part Number: 595-SN74LVC2G07DCKT; Mouser Price/Stock: https://www.mouser.co.uk/ProductDetail/Texas-Instruments/SN74LVC2G07DCKT?qs=pajgIaoyDUh%252B8BjKWdvxSw%3D%3D; Manufacturer_Part_Number: SN74LVC2G07DCKT; Datasheet Link: http://www.ti.com/lit/gpn/SN74LVC2G07; Part Number: GIC-000000009; MAN: Texas Instruments; MANREF: SN74LVC2G07DCKT; NOTE: _

## Sheet I2C.SchDoc
size A4
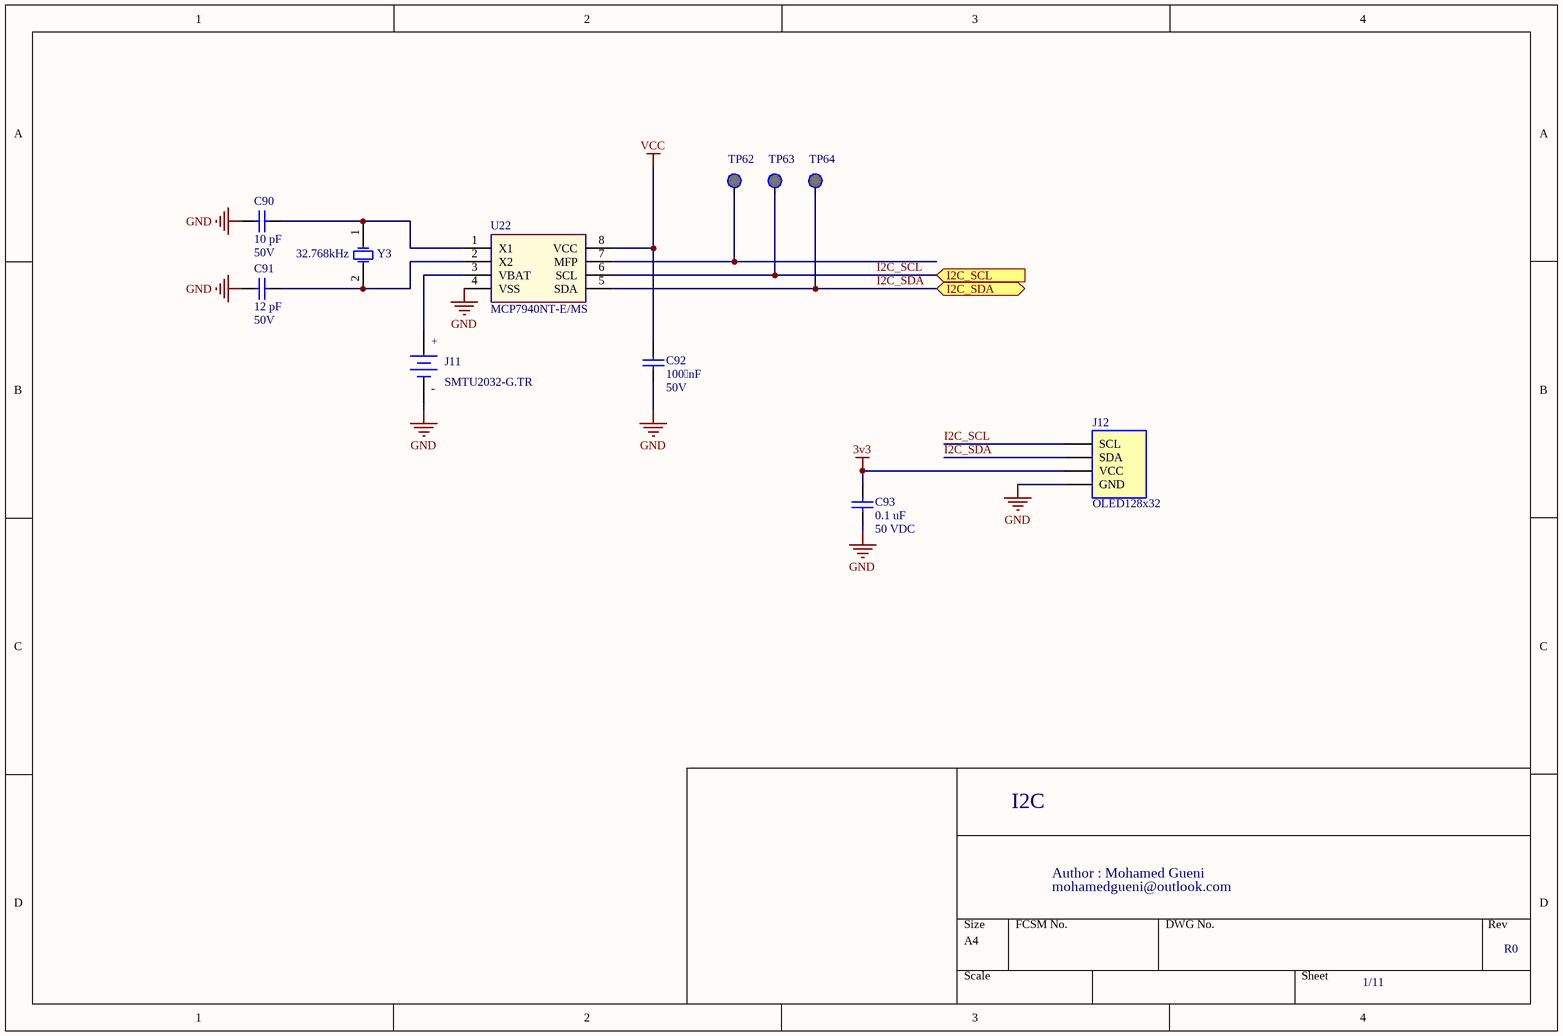
[diagram p12: I2C.SchDoc]

### Parts
C90  Value 1: 10 pF  Value 2: 50V  [CAPC1608N]
C91  Value 1: 12 pF  Value 2: 50V  [CAPC1608N]
C92  Value 1: 100 nF  Value 2: 50V  [CAPC1608N]  (hidden comment: GRM188R71H104KA93D)
C93  Value 1: 0.1 uF  Value 2: 50 VDC  [CAPC1608N]  (hidden comment: Capacitor)
J11  SMTU2032-G.TR  [SMTU2032GTR]
J12  OLED128x32  [OLED128x32]
TP62  Test Point  [TP]  (value not drawn)  (no BOM)
TP63  Test Point  [TP]  (value not drawn)  (no BOM)
TP64  Test Point  [TP]  (value not drawn)  (no BOM)
U22  MCP7940NT-E/MS  [SOP65P490X110-8N]
Y3  Value 1: 32.768kHz  [XT1312HHRXX32K76E]  (hidden comment: XT1312HHRXX32K76E)

### Ports
I2C_SCL (in), I2C_SDA (bidir)

### Nets
3V3: C93.2 J12.2(VCC)
GND: C90.1 C91.1 C92.1 C93.1 J11.2(-) J12.1(GND) U22.4(VSS)
VCC: C92.2 U22.8(VCC)
I2C_SCL: J12.4(SCL) TP63.1 U22.6(SCL) ; port I2C_SCL
I2C_SDA: J12.3(SDA) TP64.1 U22.5(SDA) ; port I2C_SDA
NetC90_2: C90.2 U22.1(X1) Y3.1(OSC1)
NetC91_2: C91.2 U22.2(X2) Y3.2(OSC2)
NetJ11_1: J11.1(+) U22.3(VBAT)
NetTP62_1: TP62.1 U22.7(MFP)

### Notes on the sheet
- I2C
- Author : Mohamed Gueni
- mohamedgueni@outlook.com
- 1/11
- R0

### Library data of the parts
C90 = CAP-000000033: FTP: 603; Part Number: CAP-000000033
C91 = CAP-000000032: FTP: 603; Part Number: CAP-000000032
C92 = CAP-000000017: as C19-C21 on sheet RPI; Part Number: CAP-000000017; MANREF: GRM188R71H104KA93D
C93 = CAP-000000060: as C76 on sheet CPU_superviser
J11 = CON-000000012: MAN: Renata; DES: Coin Cell Battery Holders SMT HLDR-T&R-GLD CON FOR CR2032MFR; Value 1: _; FTP: SMT; SUP: Mouser; SUPREF: 614-SMTU2032-G.TR; Part Number: CON-000000012; MANREF: SMTU2032-G.TR; Value 2: _; TOL: _; NOTE: _
J12 = CON-000000009: TOL: _; FTP: THT; SUP: Mouser; MAN: Samtec; MANREF: CES-104-02-S-S; SUPREF: 200-CES10402SS; Part Number: CON-000000009; NOTE: _
TP62-TP64 = MIS-000000003: Part Number: MIS-000000002; MAN: _; MANREF: _; DES: _; Value 1: _; Value 2: _; TOL: _; FTP: _; SUP: _; SUPREF: _; NOTE: _
U22 = GIC-000000014: Real Time Clock I2C GP RTCC 64B SRAM, EXT; MAN: Microchip Technology; TOL: _; FTP: MSOP-8; SUP: Mouser; SUPREF: 579-MCP7940NT-E/MS; Part Number: GIC-000000014; MANREF: MCP7940NT-E/MS; DES: Real Time Clock I2C GP RTCC 64B SRAM, EXT; NOTE: _
Y3 = Y-000000006: MAN: Vishay; DES: Crystals Xtal 3.2X1.5, 12.5pF, 32.768kHz; Value 2: 12pF; TOL: 30 PPM; SUP: Mouser; SUPREF: 70-XT1312HHRXX32K76E; NOTE: _; Part Number: Y-000000006; MANREF: XT1312HHRXX32K76E

## Sheet ETHERNET.SchDoc
size A1
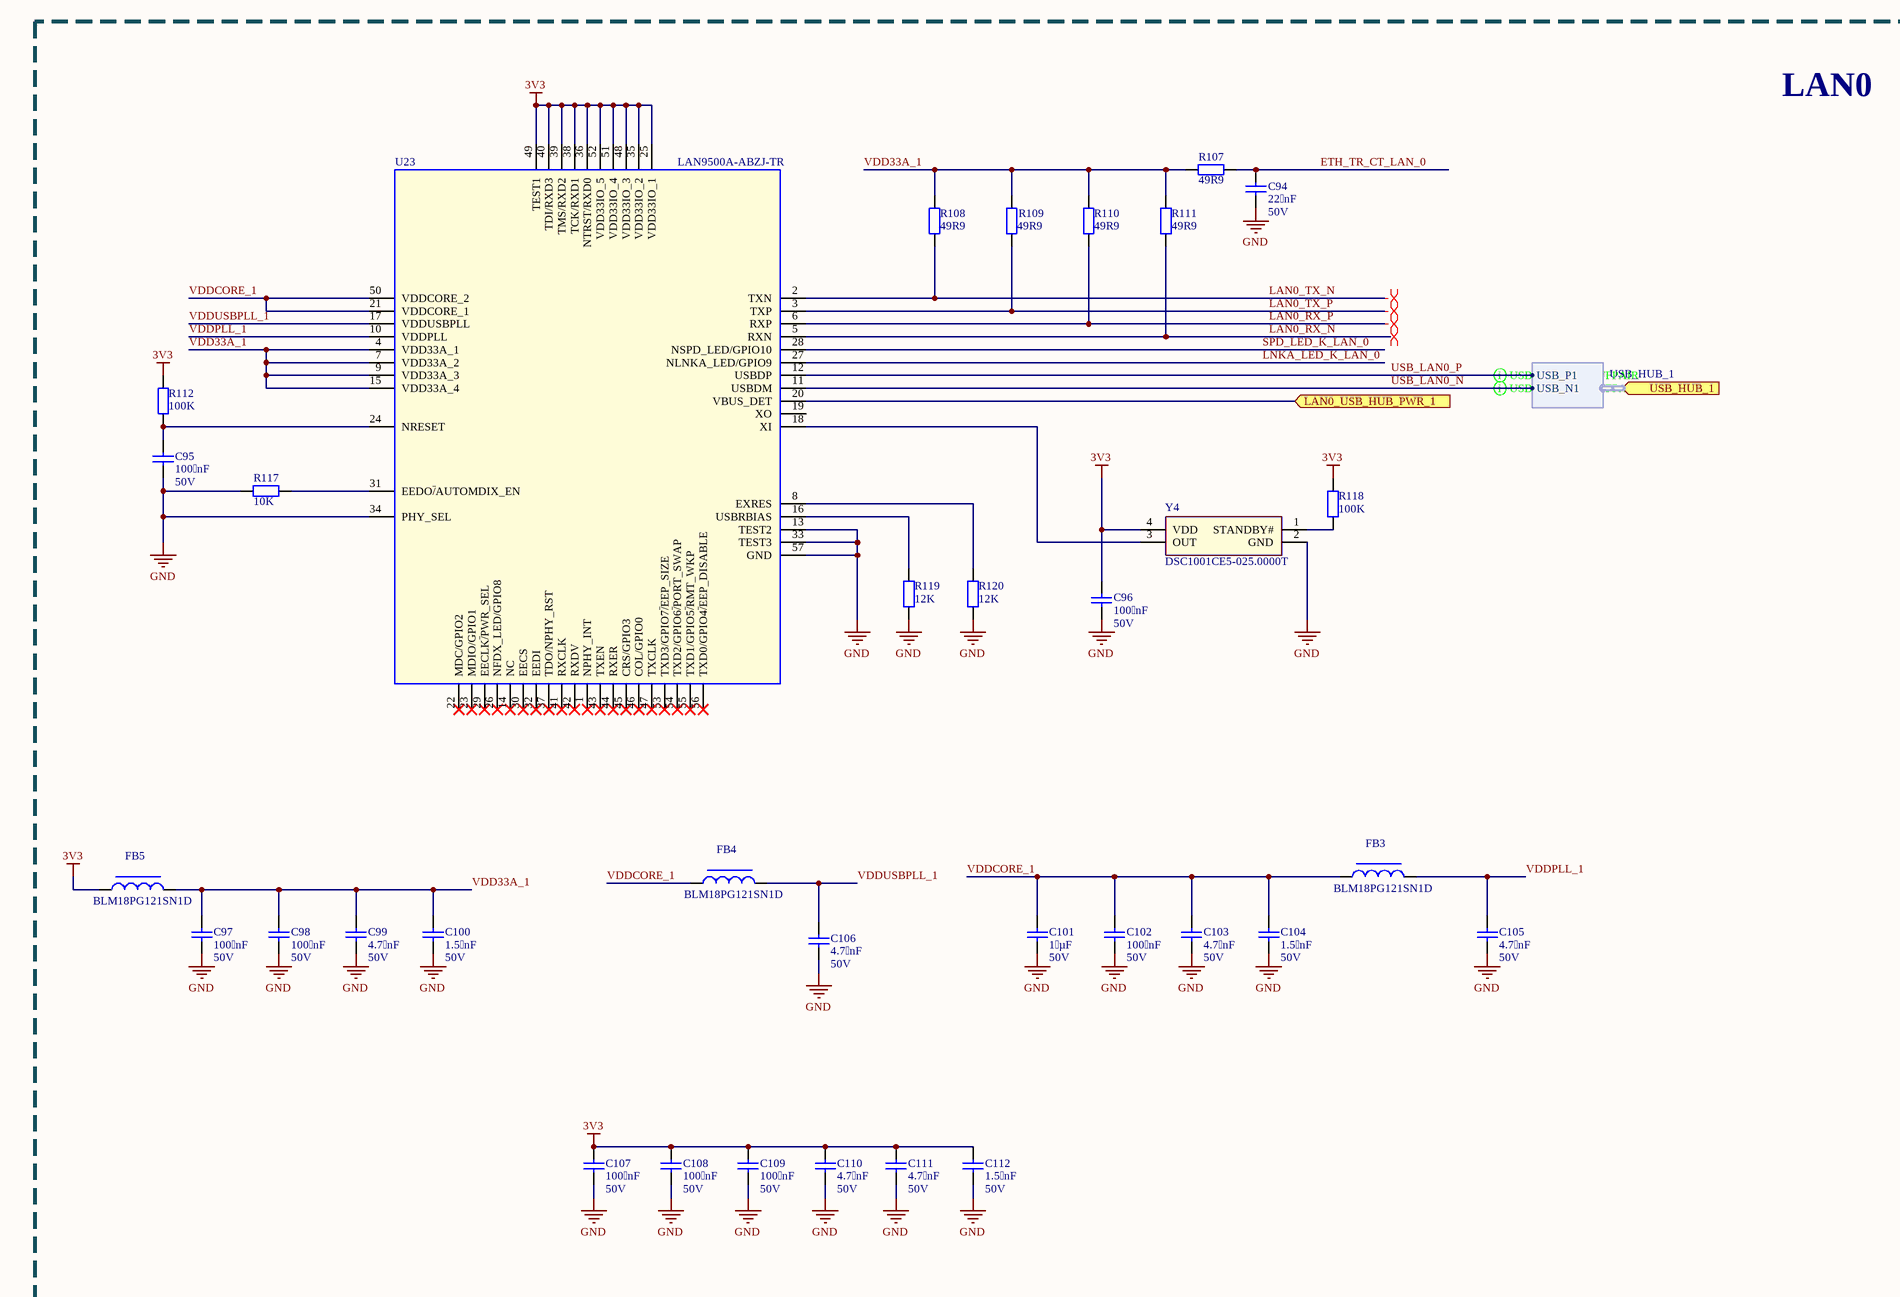
[diagram p13: ETHERNET.SchDoc, top left]
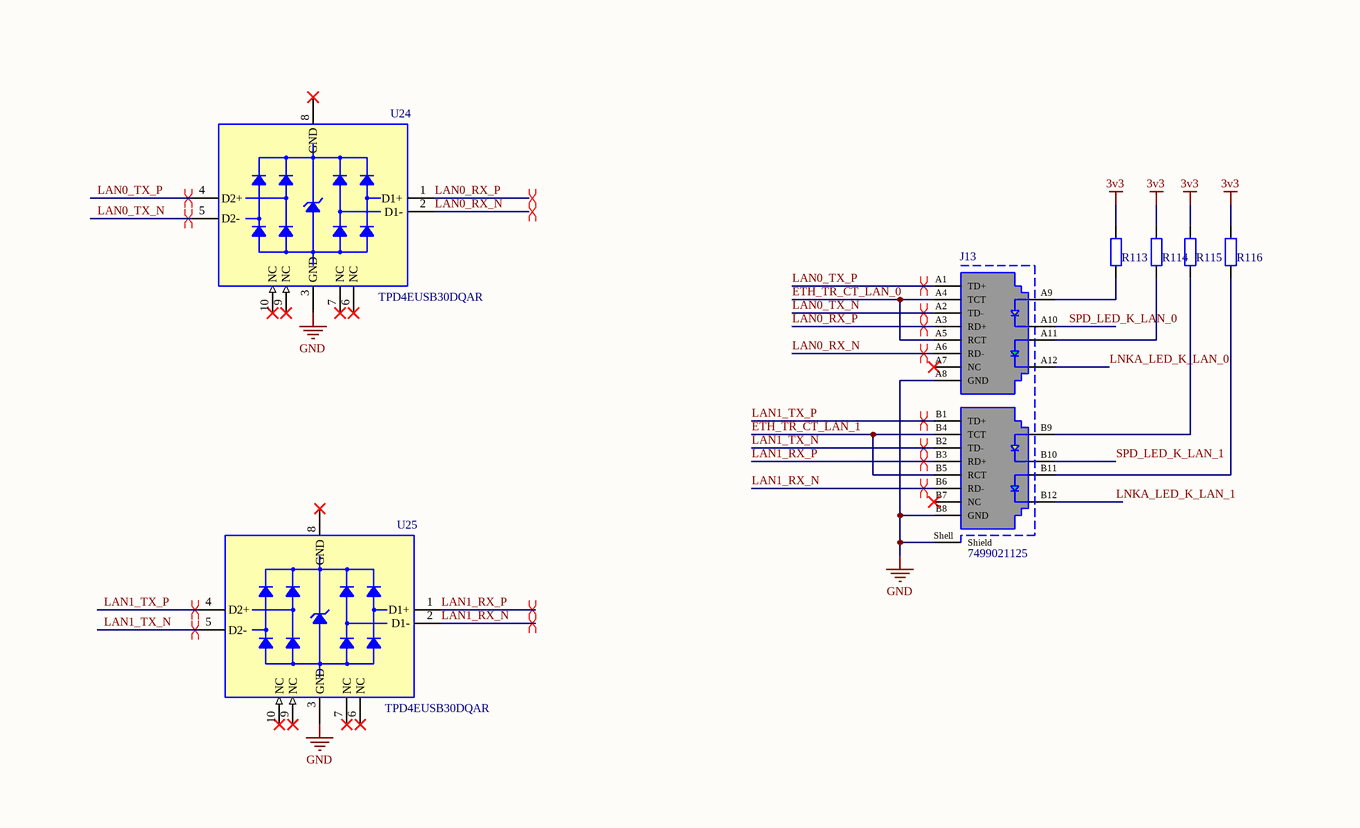
[diagram p14: ETHERNET.SchDoc, top right]
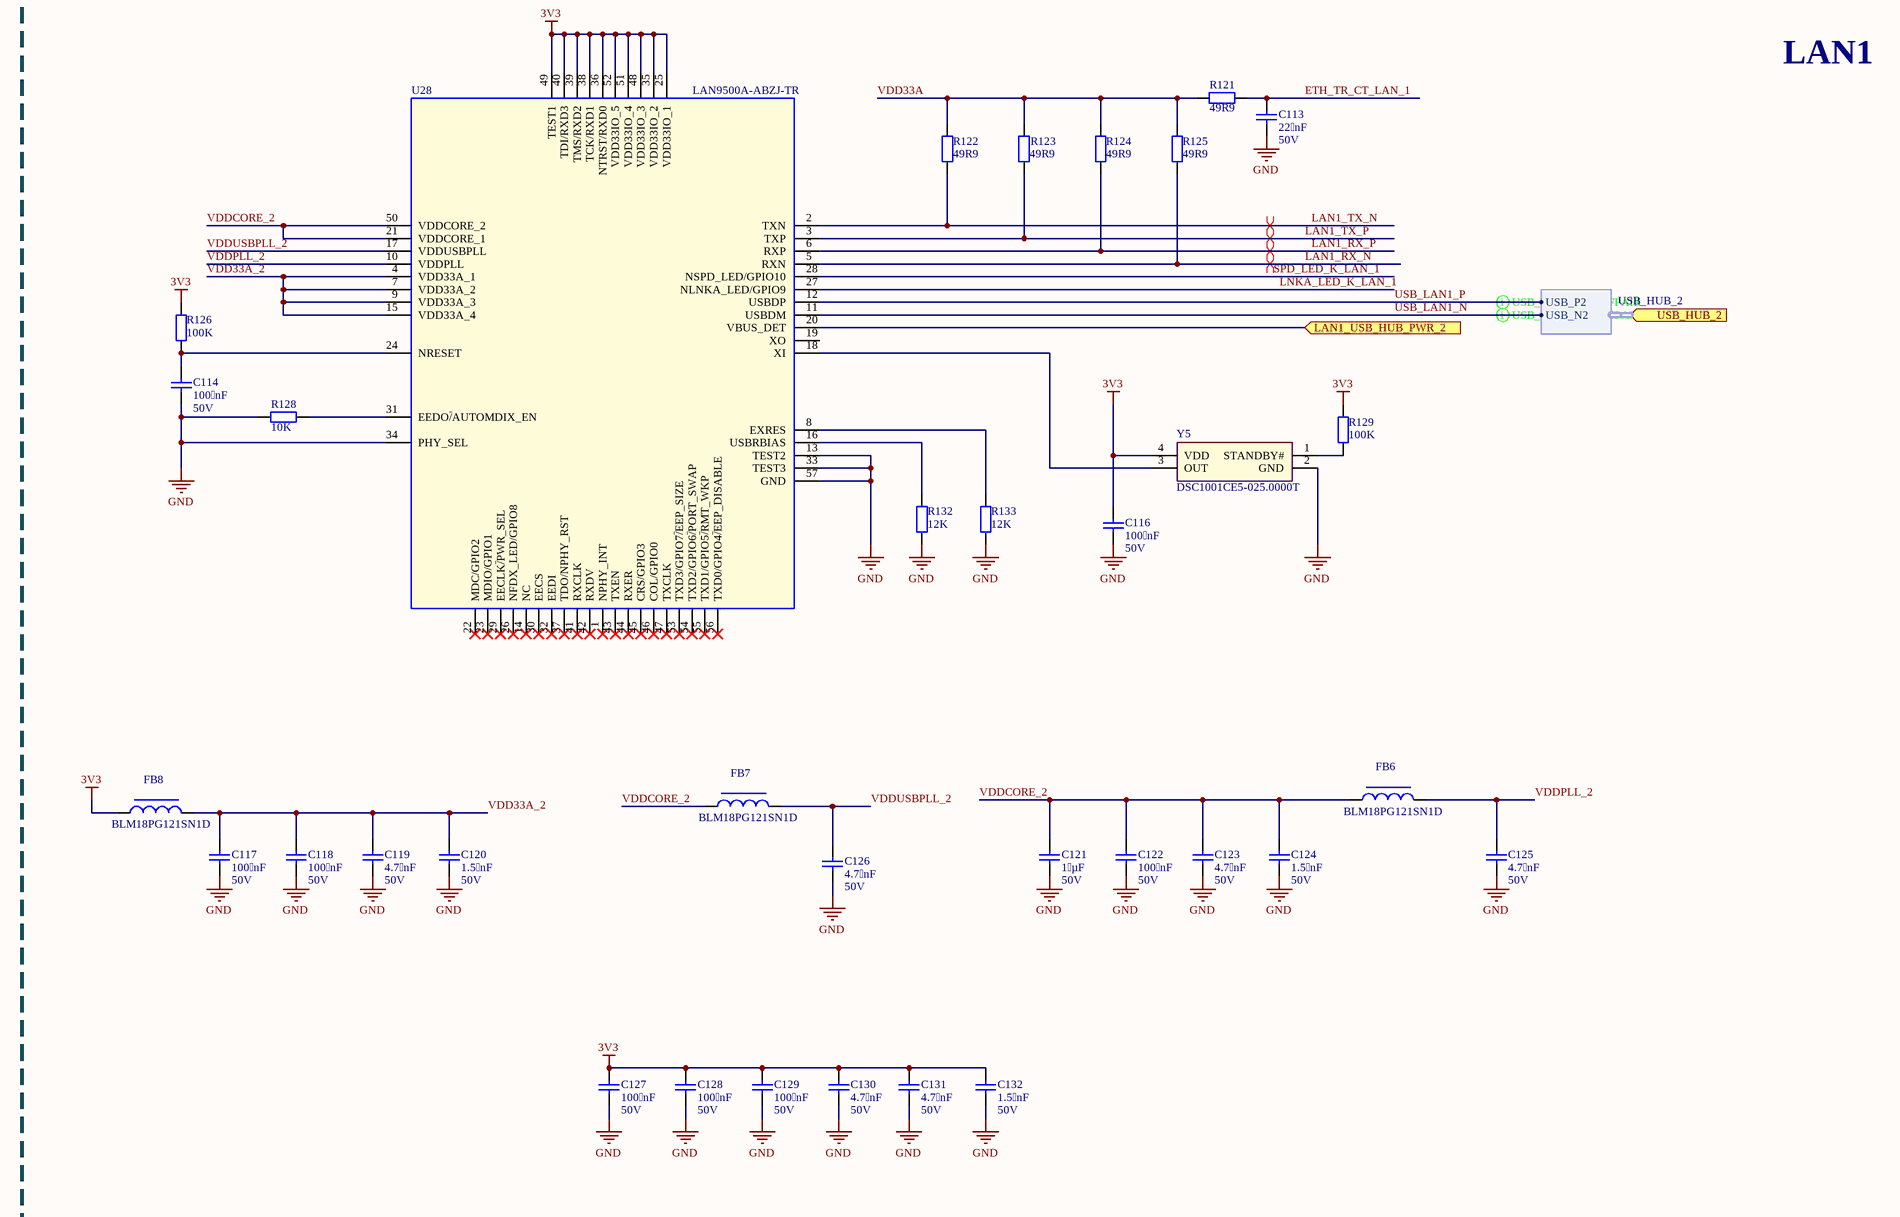
[diagram p15: ETHERNET.SchDoc, bottom left]
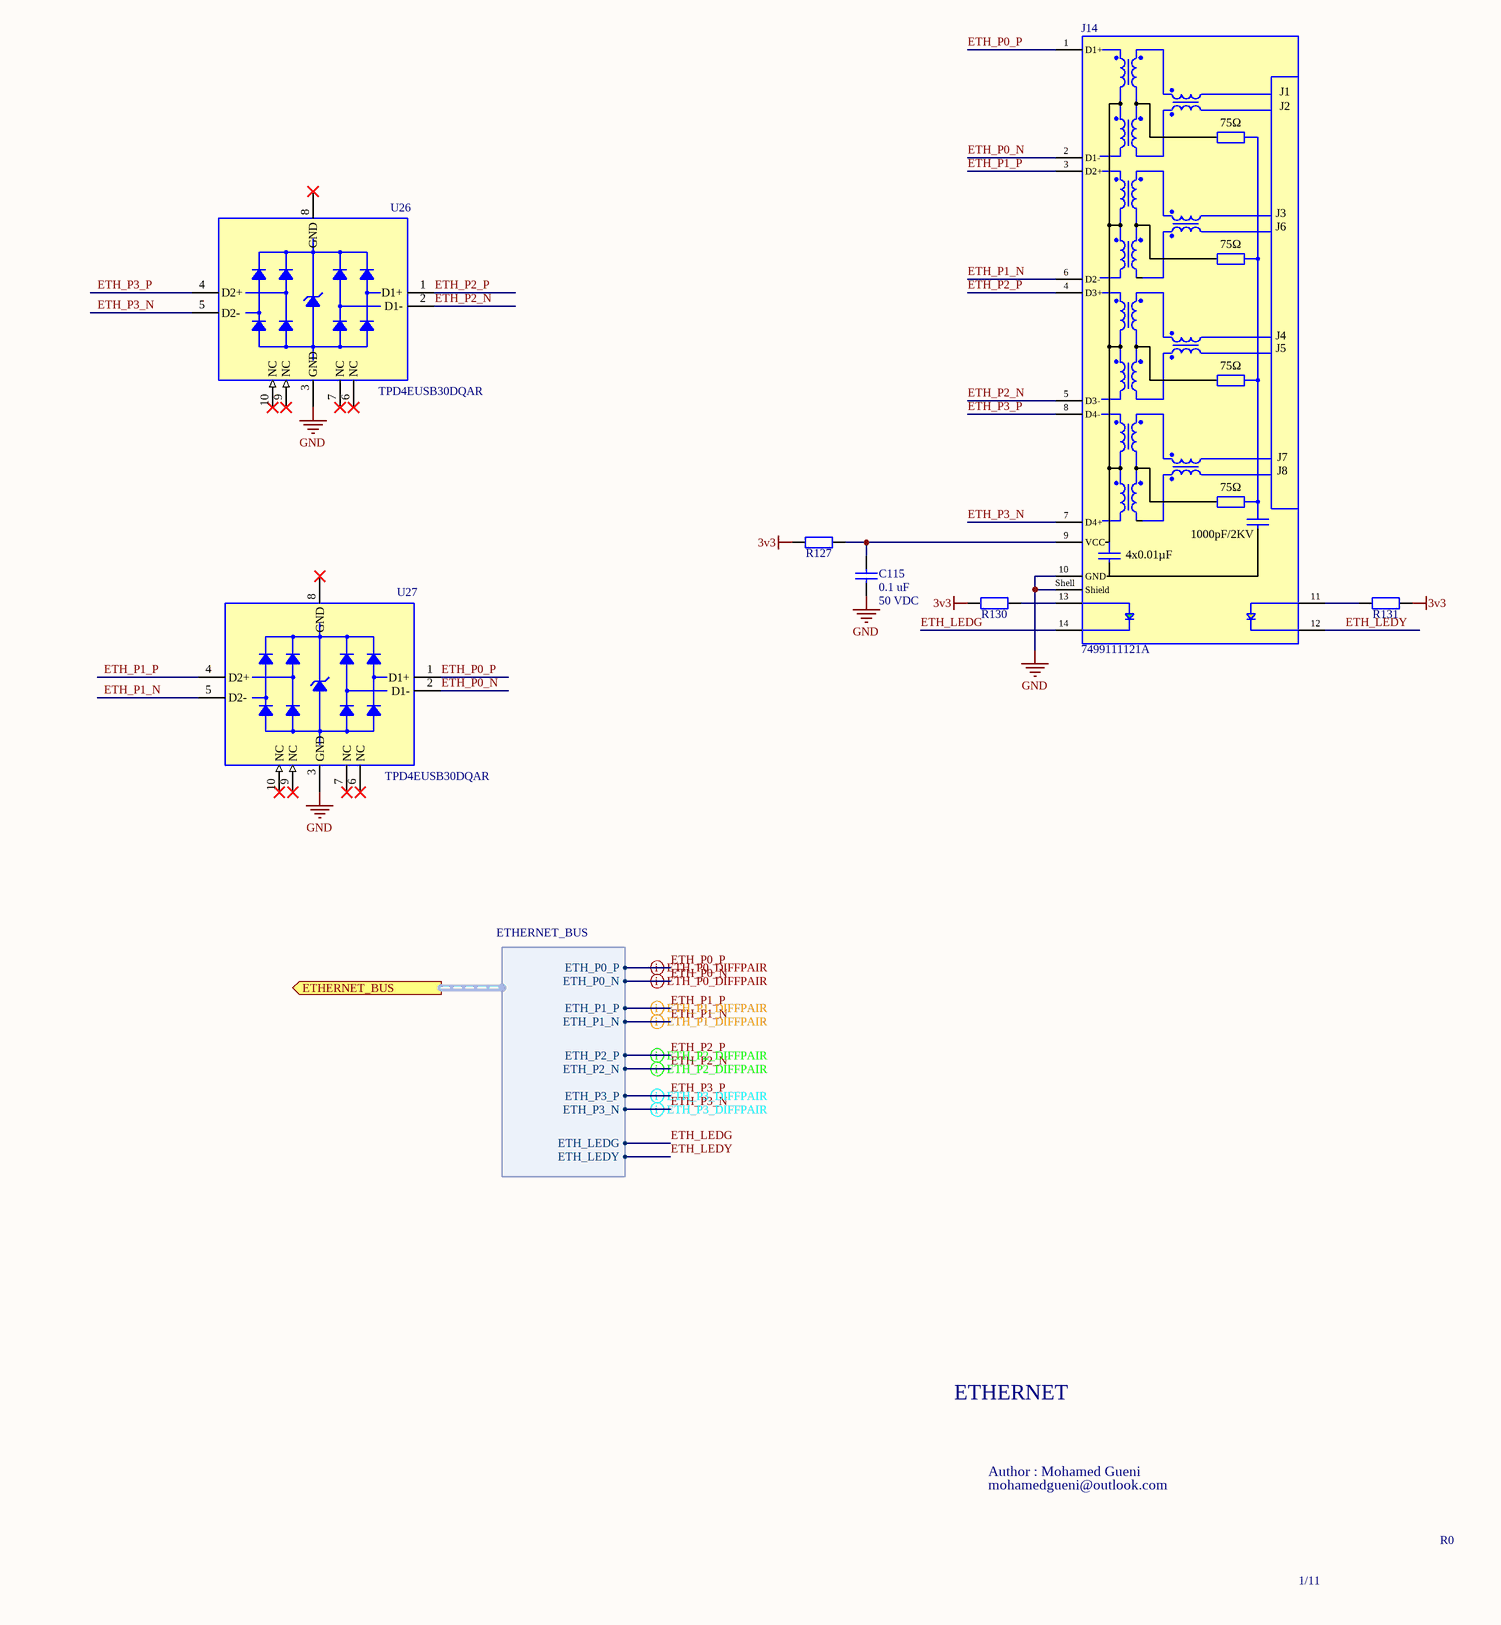
[diagram p16: ETHERNET.SchDoc, bottom right]

### Parts
C94  Value 1: 22 nF  Value 2: 50V  [CAPC1608N]  (hidden comment: GRM188R71H223KA01D)
C95  Value 1: 100 nF  Value 2: 50V  [CAPC1608N]  (hidden comment: GRM188R71H104KA93D)
C96  Value 1: 100 nF  Value 2: 50V  [CAPC1608N]  (hidden comment: GRM188R71H104KA93D)
C97  Value 1: 100 nF  Value 2: 50V  [CAPC1608N]  (hidden comment: GRM188R71H104KA93D)
C98  Value 1: 100 nF  Value 2: 50V  [CAPC1608N]  (hidden comment: GRM188R71H104KA93D)
C99  Value 1: 4.7 nF  Value 2: 50V  [CAPC1608N]  (hidden comment: GRM188R71H472KA01D)
C100  Value 1: 1.5 nF  Value 2: 50V  [CAPC1608N]  (hidden comment: GRM188R71H152KA01D)
C101  Value 1: 1 µF  Value 2: 50V  [CAPC1608N]  (hidden comment: GRM188R61H105KAALD)
C102  Value 1: 100 nF  Value 2: 50V  [CAPC1608N]  (hidden comment: GRM188R71H104KA93D)
C103  Value 1: 4.7 nF  Value 2: 50V  [CAPC1608N]  (hidden comment: GRM188R71H472KA01D)
C104  Value 1: 1.5 nF  Value 2: 50V  [CAPC1608N]  (hidden comment: GRM188R71H152KA01D)
C105  Value 1: 4.7 nF  Value 2: 50V  [CAPC1608N]  (hidden comment: GRM188R71H472KA01D)
C106  Value 1: 4.7 nF  Value 2: 50V  [CAPC1608N]  (hidden comment: GRM188R71H472KA01D)
C107  Value 1: 100 nF  Value 2: 50V  [CAPC1608N]  (hidden comment: GRM188R71H104KA93D)
C108  Value 1: 100 nF  Value 2: 50V  [CAPC1608N]  (hidden comment: GRM188R71H104KA93D)
C109  Value 1: 100 nF  Value 2: 50V  [CAPC1608N]  (hidden comment: GRM188R71H104KA93D)
C110  Value 1: 4.7 nF  Value 2: 50V  [CAPC1608N]  (hidden comment: GRM188R71H472KA01D)
C111  Value 1: 4.7 nF  Value 2: 50V  [CAPC1608N]  (hidden comment: GRM188R71H472KA01D)
C112  Value 1: 1.5 nF  Value 2: 50V  [CAPC1608N]  (hidden comment: GRM188R71H152KA01D)
C113  Value 1: 22 nF  Value 2: 50V  [CAPC1608N]  (hidden comment: GRM188R71H223KA01D)
C114  Value 1: 100 nF  Value 2: 50V  [CAPC1608N]  (hidden comment: GRM188R71H104KA93D)
C115  Value 1: 0.1 uF  Value 2: 50 VDC  [CAPC1608N]  (hidden comment: Capacitor)
C116  Value 1: 100 nF  Value 2: 50V  [CAPC1608N]  (hidden comment: GRM188R71H104KA93D)
C117  Value 1: 100 nF  Value 2: 50V  [CAPC1608N]  (hidden comment: GRM188R71H104KA93D)
C118  Value 1: 100 nF  Value 2: 50V  [CAPC1608N]  (hidden comment: GRM188R71H104KA93D)
C119  Value 1: 4.7 nF  Value 2: 50V  [CAPC1608N]  (hidden comment: GRM188R71H472KA01D)
C120  Value 1: 1.5 nF  Value 2: 50V  [CAPC1608N]  (hidden comment: GRM188R71H152KA01D)
C121  Value 1: 1 µF  Value 2: 50V  [CAPC1608N]  (hidden comment: GRM188R61H105KAALD)
C122  Value 1: 100 nF  Value 2: 50V  [CAPC1608N]  (hidden comment: GRM188R71H104KA93D)
C123  Value 1: 4.7 nF  Value 2: 50V  [CAPC1608N]  (hidden comment: GRM188R71H472KA01D)
C124  Value 1: 1.5 nF  Value 2: 50V  [CAPC1608N]  (hidden comment: GRM188R71H152KA01D)
C125  Value 1: 4.7 nF  Value 2: 50V  [CAPC1608N]  (hidden comment: GRM188R71H472KA01D)
C126  Value 1: 4.7 nF  Value 2: 50V  [CAPC1608N]  (hidden comment: GRM188R71H472KA01D)
C127  Value 1: 100 nF  Value 2: 50V  [CAPC1608N]  (hidden comment: GRM188R71H104KA93D)
C128  Value 1: 100 nF  Value 2: 50V  [CAPC1608N]  (hidden comment: GRM188R71H104KA93D)
C129  Value 1: 100 nF  Value 2: 50V  [CAPC1608N]  (hidden comment: GRM188R71H104KA93D)
C130  Value 1: 4.7 nF  Value 2: 50V  [CAPC1608N]  (hidden comment: GRM188R71H472KA01D)
C131  Value 1: 4.7 nF  Value 2: 50V  [CAPC1608N]  (hidden comment: GRM188R71H472KA01D)
C132  Value 1: 1.5 nF  Value 2: 50V  [CAPC1608N]  (hidden comment: GRM188R71H152KA01D)
FB3  BLM18PG121SN1D  [BLM18SP221SN1B]
FB4  BLM18PG121SN1D  [BLM18SP221SN1B]
FB5  BLM18PG121SN1D  [BLM18SP221SN1B]
FB6  BLM18PG121SN1D  [BLM18SP221SN1B]
FB7  BLM18PG121SN1D  [BLM18SP221SN1B]
FB8  BLM18PG121SN1D  [BLM18SP221SN1B]
J13  7499021125  [WE-RJ45-7499021125]
J14  7499111121A  [WE-RJ45-7499111121A]
R107  Value 1: 49R9  [RESC1608N]
R108  Value 1: 49R9  [RESC1608N]
R109  Value 1: 49R9  [RESC1608N]
R110  Value 1: 49R9  [RESC1608N]
R111  Value 1: 49R9  [RESC1608N]
R112  Value 1: 100K  [RESC1608N]  (hidden comment: RN731JTTD1003F100)
R113  Resistor  [RESC1608N]  (value not drawn)
R114  Resistor  [RESC1608N]  (value not drawn)
R115  Resistor  [RESC1608N]  (value not drawn)
R116  Resistor  [RESC1608N]  (value not drawn)
R117  Value 1: 10K  [RESC1608N]  (hidden comment: RN731JTTD1002F25)
R118  Value 1: 100K  [RESC1608N]  (hidden comment: RN731JTTD1003F100)
R119  Value 1: 12K  [RESC1608N]  (hidden comment: RN73H1JTTD1202F100)
R120  Value 1: 12K  [RESC1608N]  (hidden comment: RN73H1JTTD1202F100)
R121  Value 1: 49R9  [RESC1608N]
R122  Value 1: 49R9  [RESC1608N]
R123  Value 1: 49R9  [RESC1608N]
R124  Value 1: 49R9  [RESC1608N]
R125  Value 1: 49R9  [RESC1608N]
R126  Value 1: 100K  [RESC1608N]  (hidden comment: RN731JTTD1003F100)
R127  Resistor  [RESC1608N]  (value not drawn)
R128  Value 1: 10K  [RESC1608N]  (hidden comment: RN731JTTD1002F25)
R129  Value 1: 100K  [RESC1608N]  (hidden comment: RN731JTTD1003F100)
R130  Resistor  [RESC1608N]  (value not drawn)
R131  Resistor  [RESC1608N]  (value not drawn)
R132  Value 1: 12K  [RESC1608N]  (hidden comment: RN73H1JTTD1202F100)
R133  Value 1: 12K  [RESC1608N]  (hidden comment: RN73H1JTTD1202F100)
U23  LAN9500A-ABZJ-TR  [QFN50P800X800X100-57N-D]
U24  TPD4EUSB30DQAR  [USON-10]
U25  TPD4EUSB30DQAR  [USON-10]
U26  TPD4EUSB30DQAR  [USON-10]
U27  TPD4EUSB30DQAR  [USON-10]
U28  LAN9500A-ABZJ-TR  [QFN50P800X800X100-57N-D]
Y4  DSC1001CE5-025.0000T  [DSC6183CI2A032K768]
Y5  DSC1001CE5-025.0000T  [DSC6183CI2A032K768]

### Blocks framed on the sheet
LAN0: C94-C112 FB3-FB5 R107-R112 R117-R120 U23 Y4
LAN1: C113 C114 C116-C132 FB6-FB8 R121-R126 R128 R129 R132 R133 U28 Y5

### Ports
ETHERNET_BUS (out, harness ETHERNET_BUS), LAN0_USB_HUB_PWR_1 (in), LAN1_USB_HUB_PWR_2 (in), USB_HUB_1 (in, harness USB_HUB_1), USB_HUB_2 (in, harness USB_HUB_2)

### Harnesses
ETHERNET_BUS: ETH_P3_P, ETH_P3_N, ETH_P0_N, ETH_P0_P, ETH_P1_N, ETH_P1_P, ETH_P2_P, ETH_P2_N, ETH_LEDG, ETH_LEDY
USB_HUB_1: USB_N1, USB_P1
USB_HUB_2: USB_P2, USB_N2

### Nets
3V3: C96.2 C107.2 C108.2 C109.2 C110.2 C111.2 C112.2 C116.2 C127.2 C128.2 C129.2 C130.2 C131.2 C132.2 FB5.1 FB8.1 R112.2 R113.2 R114.2 R115.2 R116.2 R118.2 R126.2 R127.2 R129.2 R130.2 R131.2 U23.25(VDD33IO_1) U23.35(VDD33IO_2) U23.36(NTRST/RXD0) U23.38(TCK/RXD1) U23.39(TMS/RXD2) U23.40(TDI/RXD3) U23.48(VDD33IO_3) U23.49(TEST1) U23.51(VDD33IO_4) U23.52(VDD33IO_5) U28.25(VDD33IO_1) U28.35(VDD33IO_2) U28.36(NTRST/RXD0) U28.38(TCK/RXD1) U28.39(TMS/RXD2) U28.40(TDI/RXD3) U28.48(VDD33IO_3) U28.49(TEST1) U28.51(VDD33IO_4) U28.52(VDD33IO_5) Y4.4(VDD) Y5.4(VDD)
GND: C94.1 C95.1 C96.1 C97.1 C98.1 C99.1 C100.1 C101.1 C102.1 C103.1 C104.1 C105.1 C106.1 C107.1 C108.1 C109.1 C110.1 C111.1 C112.1 C113.1 C114.1 C115.1 C116.1 C117.1 C118.1 C119.1 C120.1 C121.1 C122.1 C123.1 C124.1 C125.1 C126.1 C127.1 C128.1 C129.1 C130.1 C131.1 C132.1 J13.A8(GND) J13.B8(GND) J13.Shell(Shield) J14.10(GND) J14.Shell(Shield) R117.2 R119.1 R120.1 R128.2 R132.1 R133.1 U23.13(TEST2) U23.33(TEST3) U23.34(PHY_SEL) U23.57(GND) U24.3(GND) U25.3(GND) U26.3(GND) U27.3(GND) U28.13(TEST2) U28.33(TEST3) U28.34(PHY_SEL) U28.57(GND) Y4.2(GND) Y5.2(GND)
ETH_LEDG: J14.14 ; port ETHERNET_BUS.ETH_LEDG
ETH_LEDY: J14.12 ; port ETHERNET_BUS.ETH_LEDY
ETH_P0_N: J14.2(D1-) U27.2(D1-) ; port ETHERNET_BUS.ETH_P0_N
ETH_P0_P: J14.1(D1+) U27.1(D1+) ; port ETHERNET_BUS.ETH_P0_P
ETH_P1_N: J14.6(D2-) U27.5(D2-) ; port ETHERNET_BUS.ETH_P1_N
ETH_P1_P: J14.3(D2+) U27.4(D2+) ; port ETHERNET_BUS.ETH_P1_P
ETH_P2_N: J14.5(D3-) U26.2(D1-) ; port ETHERNET_BUS.ETH_P2_N
ETH_P2_P: J14.4(D3+) U26.1(D1+) ; port ETHERNET_BUS.ETH_P2_P
ETH_P3_N: J14.7(D4+) U26.5(D2-) ; port ETHERNET_BUS.ETH_P3_N
ETH_P3_P: J14.8(D4-) U26.4(D2+) ; port ETHERNET_BUS.ETH_P3_P
ETH_TR_CT_LAN_0: C94.2 J13.A4(TCT) J13.A5(RCT) R107.1
ETH_TR_CT_LAN_1: C113.2 J13.B4(TCT) J13.B5(RCT) R121.1
LAN0_RX_N: J13.A6(RD-) R111.2 U23.5(RXN) U24.2(D1-)
LAN0_RX_P: J13.A3(RD+) R110.2 U23.6(RXP) U24.1(D1+)
LAN0_TX_N: J13.A2(TD-) R108.2 U23.2(TXN) U24.5(D2-)
LAN0_TX_P: J13.A1(TD+) R109.2 U23.3(TXP) U24.4(D2+)
LAN1_RX_N: J13.B6(RD-) R125.2 U25.2(D1-) U28.5(RXN)
LAN1_RX_P: J13.B3(RD+) R124.2 U25.1(D1+) U28.6(RXP)
LAN1_TX_N: J13.B2(TD-) R122.2 U25.5(D2-) U28.2(TXN)
LAN1_TX_P: J13.B1(TD+) R123.2 U25.4(D2+) U28.3(TXP)
LNKA_LED_K_LAN_0: J13.A12 U23.27(NLNKA_LED/GPIO9)
LNKA_LED_K_LAN_1: J13.B12 U28.27(NLNKA_LED/GPIO9)
SPD_LED_K_LAN_0: J13.A10 U23.28(NSPD_LED/GPIO10)
SPD_LED_K_LAN_1: J13.B10 U28.28(NSPD_LED/GPIO10)
USB_LAN0_N: U23.11(USBDM) ; port USB_HUB_1.USB_N1  [project net _D1_N]
USB_LAN0_P: U23.12(USBDP) ; port USB_HUB_1.USB_P1  [project net _D1_P]
USB_LAN1_N: U28.11(USBDM) ; port USB_HUB_2.USB_N2  [project net _D2_N]
USB_LAN1_P: U28.12(USBDP) ; port USB_HUB_2.USB_P2  [project net _D2_P]
VDD33A: R121.2 R122.1 R123.1 R124.1 R125.1
VDD33A_1: C97.2 C98.2 C99.2 C100.2 FB5.2 R107.2 R108.1 R109.1 R110.1 R111.1 U23.4(VDD33A_1) U23.7(VDD33A_2) U23.9(VDD33A_3) U23.15(VDD33A_4)
VDD33A_2: C117.2 C118.2 C119.2 C120.2 FB8.2 U28.4(VDD33A_1) U28.7(VDD33A_2) U28.9(VDD33A_3) U28.15(VDD33A_4)
VDDCORE_1: C101.2 C102.2 C103.2 C104.2 FB3.1 FB4.1 U23.21(VDDCORE_1) U23.50(VDDCORE_2)
VDDCORE_2: C121.2 C122.2 C123.2 C124.2 FB6.1 FB7.1 U28.21(VDDCORE_1) U28.50(VDDCORE_2)
VDDPLL_1: C105.2 FB3.2 U23.10(VDDPLL)
VDDPLL_2: C125.2 FB6.2 U28.10(VDDPLL)
VDDUSBPLL_1: C106.2 FB4.2 U23.17(VDDUSBPLL)
VDDUSBPLL_2: C126.2 FB7.2 U28.17(VDDUSBPLL)
NetC95_2: C95.2 R112.1 U23.24(NRESET)
NetC114_2: C114.2 R126.1 U28.24(NRESET)
NetC115_2: C115.2 J14.9(VCC) R127.1
NetJ13_A9: J13.A9 R113.1
NetJ13_A11: J13.A11 R114.1
NetJ13_B9: J13.B9 R115.1
NetJ13_B11: J13.B11 R116.1
NetJ14_11: J14.11 R131.1
NetJ14_13: J14.13 R130.1
NetR117_1: R117.1 U23.31(EEDO~{/}AUTOMDIX_EN)
NetR118_1: R118.1 Y4.1(STANDBY#)
NetR119_2: R119.2 U23.16(USBRBIAS)
NetR120_2: R120.2 U23.8(EXRES)
NetR128_1: R128.1 U28.31(EEDO~{/}AUTOMDIX_EN)
NetR129_1: R129.1 Y5.1(STANDBY#)
NetR132_2: R132.2 U28.16(USBRBIAS)
NetR133_2: R133.2 U28.8(EXRES)
NetU17_12: U23.20(VBUS_DET) ; port LAN0_USB_HUB_PWR_1
NetU17_16: U28.20(VBUS_DET) ; port LAN1_USB_HUB_PWR_2
NetU23_18: U23.18(XI) Y4.3(OUT)
NetU28_18: U28.18(XI) Y5.3(OUT)

Not connected (* = marked no-connect by the designer): J13 A7(NC)* B7(NC)*; U23 1(NPHY_INT)* 14(NC)* 19(XO) 22(MDC/GPIO2)* 23(MDIO/GPIO1)* 26(NFDX_LED/GPIO8)* 29(EECLK~{/}PWR_SEL)* 30(EECS)* 32(EEDI)* 37(TDO/NPHY_RST)* 41(RXCLK)* 42(RXDV)* 43(TXEN)* 44(RXER)* 45(CRS/GPIO3)* 46(COL/GPIO0)* 47(TXCLK)* 53(TXD3/GPIO7~{/}EEP_SIZE)* 54(TXD2/GPIO6~{/}PORT_SWAP)* 55(TXD1/GPIO5~{/}RMT_WKP)* 56(TXD0/GPIO4~{/}EEP_DISABLE)*; U24 6(NC)* 7(NC)* 8(GND)* 9(NC)* 10(NC)*; U25 6(NC)* 7(NC)* 8(GND)* 9(NC)* 10(NC)*; U26 6(NC)* 7(NC)* 8(GND)* 9(NC)* 10(NC)*; U27 6(NC)* 7(NC)* 8(GND)* 9(NC)* 10(NC)*; U28 1(NPHY_INT)* 14(NC)* 19(XO) 22(MDC/GPIO2)* 23(MDIO/GPIO1)* 26(NFDX_LED/GPIO8)* 29(EECLK~{/}PWR_SEL)* 30(EECS)* 32(EEDI)* 37(TDO/NPHY_RST)* 41(RXCLK)* 42(RXDV)* 43(TXEN)* 44(RXER)* 45(CRS/GPIO3)* 46(COL/GPIO0)* 47(TXCLK)* 53(TXD3/GPIO7~{/}EEP_SIZE)* 54(TXD2/GPIO6~{/}PORT_SWAP)* 55(TXD1/GPIO5~{/}RMT_WKP)* 56(TXD0/GPIO4~{/}EEP_DISABLE)*

### Layout directives
differential pair; differential pair class ETH_P0_DIFFPAIR: ETH_P0_N, ETH_P0_P
differential pair; differential pair class ETH_P1_DIFFPAIR: ETH_P1_N, ETH_P1_P
differential pair; differential pair class ETH_P2_DIFFPAIR: ETH_P2_N, ETH_P2_P
differential pair; differential pair class ETH_P3_DIFFPAIR: ETH_P3_N, ETH_P3_P
differential pair: LAN0_RX_N, LAN0_RX_P, LAN0_TX_N, LAN0_TX_P, LAN1_RX_N, LAN1_RX_P, LAN1_TX_N, LAN1_TX_P
differential pair; differential pair class USB_P_LAN0_DIFFPAIR: _D1_N, _D1_P
differential pair; differential pair class USB_P_LAN1_DIFFPAIR: _D2_N, _D2_P

### Notes on the sheet
- ETHERNET
- Author : Mohamed Gueni
- mohamedgueni@outlook.com
- 1/11
- R0
- (in symbol CON-000000049) J1; J2; 75Ω; J3; J6; J4; J5; J7; J8; 1000pF/2KV; 4x0.01µF

### Library data of the parts
C94 C113 = CAP-000000023: MAN: Murata; DES: Ceramic Capacitor, 22 nF, 50V, X7R, 0603; FTP: 603; SUPREF: 81-GRM188R71H223KA01D; Part Number: CAP-000000023; MANREF: GRM188R71H223KA01D
C95-C98 C102 C107-C109 C114 C116-C118 C122 C127-C129 = CAP-000000017: as C19-C21 on sheet RPI; Part Number: CAP-000000017; MANREF: GRM188R71H104KA93D
C99 C103 C105 C106 C110 C111 C119 C123 C125 C126 C130 C131 = CAP-000000019: MAN: Murata; DES: Ceramic Capacitor, 4.7 nF, 50V, X7R, 0603; FTP: 603; SUPREF: 81-GRM188R71H472KA01D; Part Number: CAP-000000019; MANREF: GRM188R71H472KA01D
C100 C104 C112 C120 C124 C132 = CAP-000000020: MAN: Murata; DES: Ceramic Capacitor, 1.5 nF, 50V, X7R, 0603; FTP: 603; SUPREF: 81-GRM188R71H152KA01D; Part Number: CAP-000000020; MANREF: GRM188R71H152KA01D
C101 C121 = CAP-000000018: MAN: Murata; DES: Ceramic Capacitor, 1 µF, 50V, X5R, 0603; FTP: 603; SUPREF: 81-GRM188R61H105KAALD; Part Number: CAP-000000018; MANREF: GRM188R61H105KAALD
C115 = CAP-000000060: as C76 on sheet CPU_superviser
FB3-FB8 = F-000000001: MAN: Murata Electronics; DES: Ferrite Beads 120 OHM 25% Alternate Sizing Guide Below; Value 1: 120 Ohms; Value 2: 2 A; TOL: 25 %; FTP: F0603; SUP: Mouser; SUPREF: 81-BLM18PG121SN1D; NOTE: _; Part Number: F-000000001; MANREF: BLM18PG121SN1D
J13 = CON-000000054: Part Number: CON-000000008; MAN: Wurth Elektronik; DES: Modular Connectors / Ethernet Connectors WE-RJ45 Intgtd XFMR 1x2 THT Tab Down EMI; Value 1: _; Value 2: 10/100BaseT; FTP: THT; SUP: Mouser; SUPREF: 710-7499021125; MANREF: 7499021125; TOL: _; NOTE: _
J14 = CON-000000049: Part Number: CON-000000002; MAN: Wurth Elektronik; DES: Modular Connectors / Ethernet Connectors WE-RJ45 Intgtd XFMR 1x1 THT Tab Down EMI; Value 1: _; Value 2: 10/100/1000BaseT; FTP: THT; SUP: Mouser; SUPREF: 710-7499111121A; MANREF: 7499111121A; TOL: _; NOTE: _
R107-R111 R121-R125 = RES-000000134: Part Number: RES-0000000010; TOL: 1%; SUP: Mouser; NOTE: _
R112 R118 R126 R129 = RES-000000126: Part Number: RES-000000002; MAN: KOA Speer; DES: Thin Film Resistors - SMD 0603 100 Kohms 1% 10PPM; Value 2: 0.63W; TOL: 1%; FTP: 0603; SUP: Mouser; SUPREF: 660-RN731JTD1003F100; NOTE: _; MANREF: RN731JTTD1003F100
R113-R116 R127 R130 R131 = RES-000000132: Part Number: RES-000000008; MAN: KOA Speer; Value 1: 330R; SUP: Mouser; NOTE: _
R117 R128 = RES-000000131: Part Number: RES-000000007; MAN: KOA Speer; DES: Thin Film Resistors - SMD 10kOhm,0603,1%,25ppm ,63mW,50V; Value 2: 0.63W; TOL: 1%; FTP: 0603; SUP: Mouser; SUPREF: 660-RN731JTTD1002F25; NOTE: _; MANREF: RN731JTTD1002F25
R119 R120 R132 R133 = RES-000000128: Part Number: RES-000000004; MAN: KOA Speer; DES: Thin Film Resistors - SMD 12kOhm,0603,1%,10ppm ,100mW,75V; Value 2: 0.1W; TOL: 1%; FTP: 0603; SUP: Mouser; SUPREF: 660-RN73H1JT1202F100; NOTE: _; MANREF: RN73H1JTTD1202F100
U23 U28 = GIC-000000010: MAN: Microchip Technology; DES: USB Interface IC Hi-Speed USB 2.0 10/100/1000 Ethernet; Value 1: 3.3 V; Value 2: 480 Mb/s; TOL: _; FTP: QFN-56; SUP: Mouser; SUPREF: 886-LAN9500A-ABZJ-TR; Part Number: GIC-000000010; MANREF: LAN9500A-ABZJ-TR; NOTE: _
U24-U27 = TVS-000000007: Part Number: TVS-000000001; MAN: Texas Instruments; DES: ESD Suppressors / TVS Diodes 4Ch ESD SOLUTION; Value 1: 7 V; Value 2: 0.05 pF; TOL: _; SUP: Mouser; SUPREF: 595-TPD4EUSB30DQAR; MANREF: TPD4EUSB30DQAR; FTP: USON-10; NOTE: _
Y4 Y5 = Y-000000007: Part Number: Y-000000001; MAN: Microchip Technology; DES: Standard Clock Oscillators MEMS Oscillator Low PWR LVCMOS -20C-70C; Value 1: 40 pF; Value 2: 25 MHz; TOL: 10 PPM; FTP: CDFN-4; SUP: Mouser; SUPREF: 579-001CE50250000T; NOTE: _; MANREF: DSC1001CE5-025.0000T

## Nets that join several sheets
3V3: USB HUB (19 pins), POWER SUPPLY (R17.2 R18.1 TP68.1), RS-485 (17 pins), SD-CARD (8 pins), CPU_superviser (12 pins), RPI (R25.2 R26.2), I2C (C93.2 J12.2), ETHERNET (49 pins)
3V8: CELLULAR (9 pins), POWER SUPPLY (R2.2 R8.1 TP65.1)
5V: POWER SUPPLY (5 pins), RS-485 (6 pins), RPI (13 pins)
GND: CELLULAR (42 pins), USB HUB (20 pins), POWER SUPPLY (24 pins), RS-485 (43 pins), SD-CARD (35 pins), CPU_superviser (12 pins), RPI (70 pins), I2C (7 pins), ETHERNET (64 pins)
RPi_3V3_OUT: POWER SUPPLY (R18.2 TP69.1), RPI (13 pins)
_D1_N: USB HUB (R75.1), ETHERNET (U23.11)
_D1_P: USB HUB (R74.1), ETHERNET (U23.12)
_D2_N: USB HUB (R80.1), ETHERNET (U28.11)
_D2_P: USB HUB (R78.1), ETHERNET (U28.12)
_D3_N: USB HUB (R84.1), RS-485 (U9.8)
_D3_P: USB HUB (R82.1), RS-485 (U9.7)
_D4_N: CELLULAR (U21.28), USB HUB (R87.1)
_D4_P: CELLULAR (U21.29), USB HUB (R86.1)
ETH_LEDG: RPI (U4.17), ETHERNET (J14.14)
ETH_LEDY: RPI (U4.15), ETHERNET (J14.12)
ETH_P0_N: RPI (U4.10), ETHERNET (J14.2 U27.2)
ETH_P0_P: RPI (U4.12), ETHERNET (J14.1 U27.1)
ETH_P1_N: RPI (U4.6), ETHERNET (J14.6 U27.5)
ETH_P1_P: RPI (U4.4), ETHERNET (J14.3 U27.4)
ETH_P2_N: RPI (U4.9), ETHERNET (J14.5 U26.2)
ETH_P2_P: RPI (U4.11), ETHERNET (J14.4 U26.1)
ETH_P3_N: RPI (U4.5), ETHERNET (J14.7 U26.5)
ETH_P3_P: RPI (U4.3), ETHERNET (J14.8 U26.4)
I2C_SCL: RPI (R25.1 U7.6), I2C (J12.4 TP63.1 U22.6)
I2C_SDA: RPI (R26.1 U7.4), I2C (J12.3 TP64.1 U22.5)
NetQ1_6: cm4gateway (R1.1), CPU_superviser (Q1.6)
NetR1_2: cm4gateway (R1.2), RPI (TP5.1 U4.92)
NetR4_1: POWER SUPPLY (R4.1 R7.2 U1.3), RPI (U4.29)
NetR15_2: POWER SUPPLY (R15.2 U2.4), CPU_superviser (R91.1)
NetR27_1: SD-CARD (R60.2 U13.3), RPI (R27.1 TP13.1)
NetR43_1: USB HUB (U17.18), RS-485 (R43.1 R44.2)
NetR101_2: CELLULAR (R101.2), USB HUB (U17.20)
NetR103_2: CELLULAR (R103.2 TP58.1), RPI (U4.37)
NetR105_2: CELLULAR (R105.2 TP60.1), RPI (U4.39)
NetU4_58: CPU_superviser (U19.14), RPI (U4.58)
NetU17_12: USB HUB (U17.12), ETHERNET (U23.20)
NetU17_16: USB HUB (U17.16), ETHERNET (U28.20)
RESET_IN: USB HUB (C68.2 R83.2 U17.26), RPI (U4.100)
RPi_RXD3: CPU_superviser (TP38.1 U19.17), RPI (R24.1 TP11.1)
RPi_TXD3: CPU_superviser (TP37.1 U19.18), RPI (R23.1 TP8.1)
SD_CLK: SD-CARD (R54.1 R66.1), RPI (U4.57)
SD_CMD: SD-CARD (R55.1 R65.1), RPI (U4.62)
SD_DAT0: SD-CARD (R53.1 R61.1), RPI (U4.63)
SD_DAT1: SD-CARD (R51.1 R62.1), RPI (U4.67)
SD_DAT2: SD-CARD (R57.1 R63.1), RPI (U4.69)
SD_DAT3: SD-CARD (R56.1 R64.1), RPI (U4.61)
SEL_SD: SD-CARD (8 pins), CPU_superviser (R93.1)
SYS_ERR_LED: CPU_superviser (D8.1 U20.3), RPI (U5.6)
SYS_NET_LED: CPU_superviser (D9.1), RPI (U6.6)
SYS_PWR_LED: CPU_superviser (D10.1), RPI (U6.4)
SYS_WAR_LED: CPU_superviser (D7.1 U20.1), RPI (U5.4)
USER_PB: CPU_superviser (C78.2 R92.1 R97.1 S1.1), RPI (R28.1)